# Altium schematic sheet PWM设计.SchDoc
size 1524 x 1524 mm; SheetNumber: 7; SheetTotal: 16
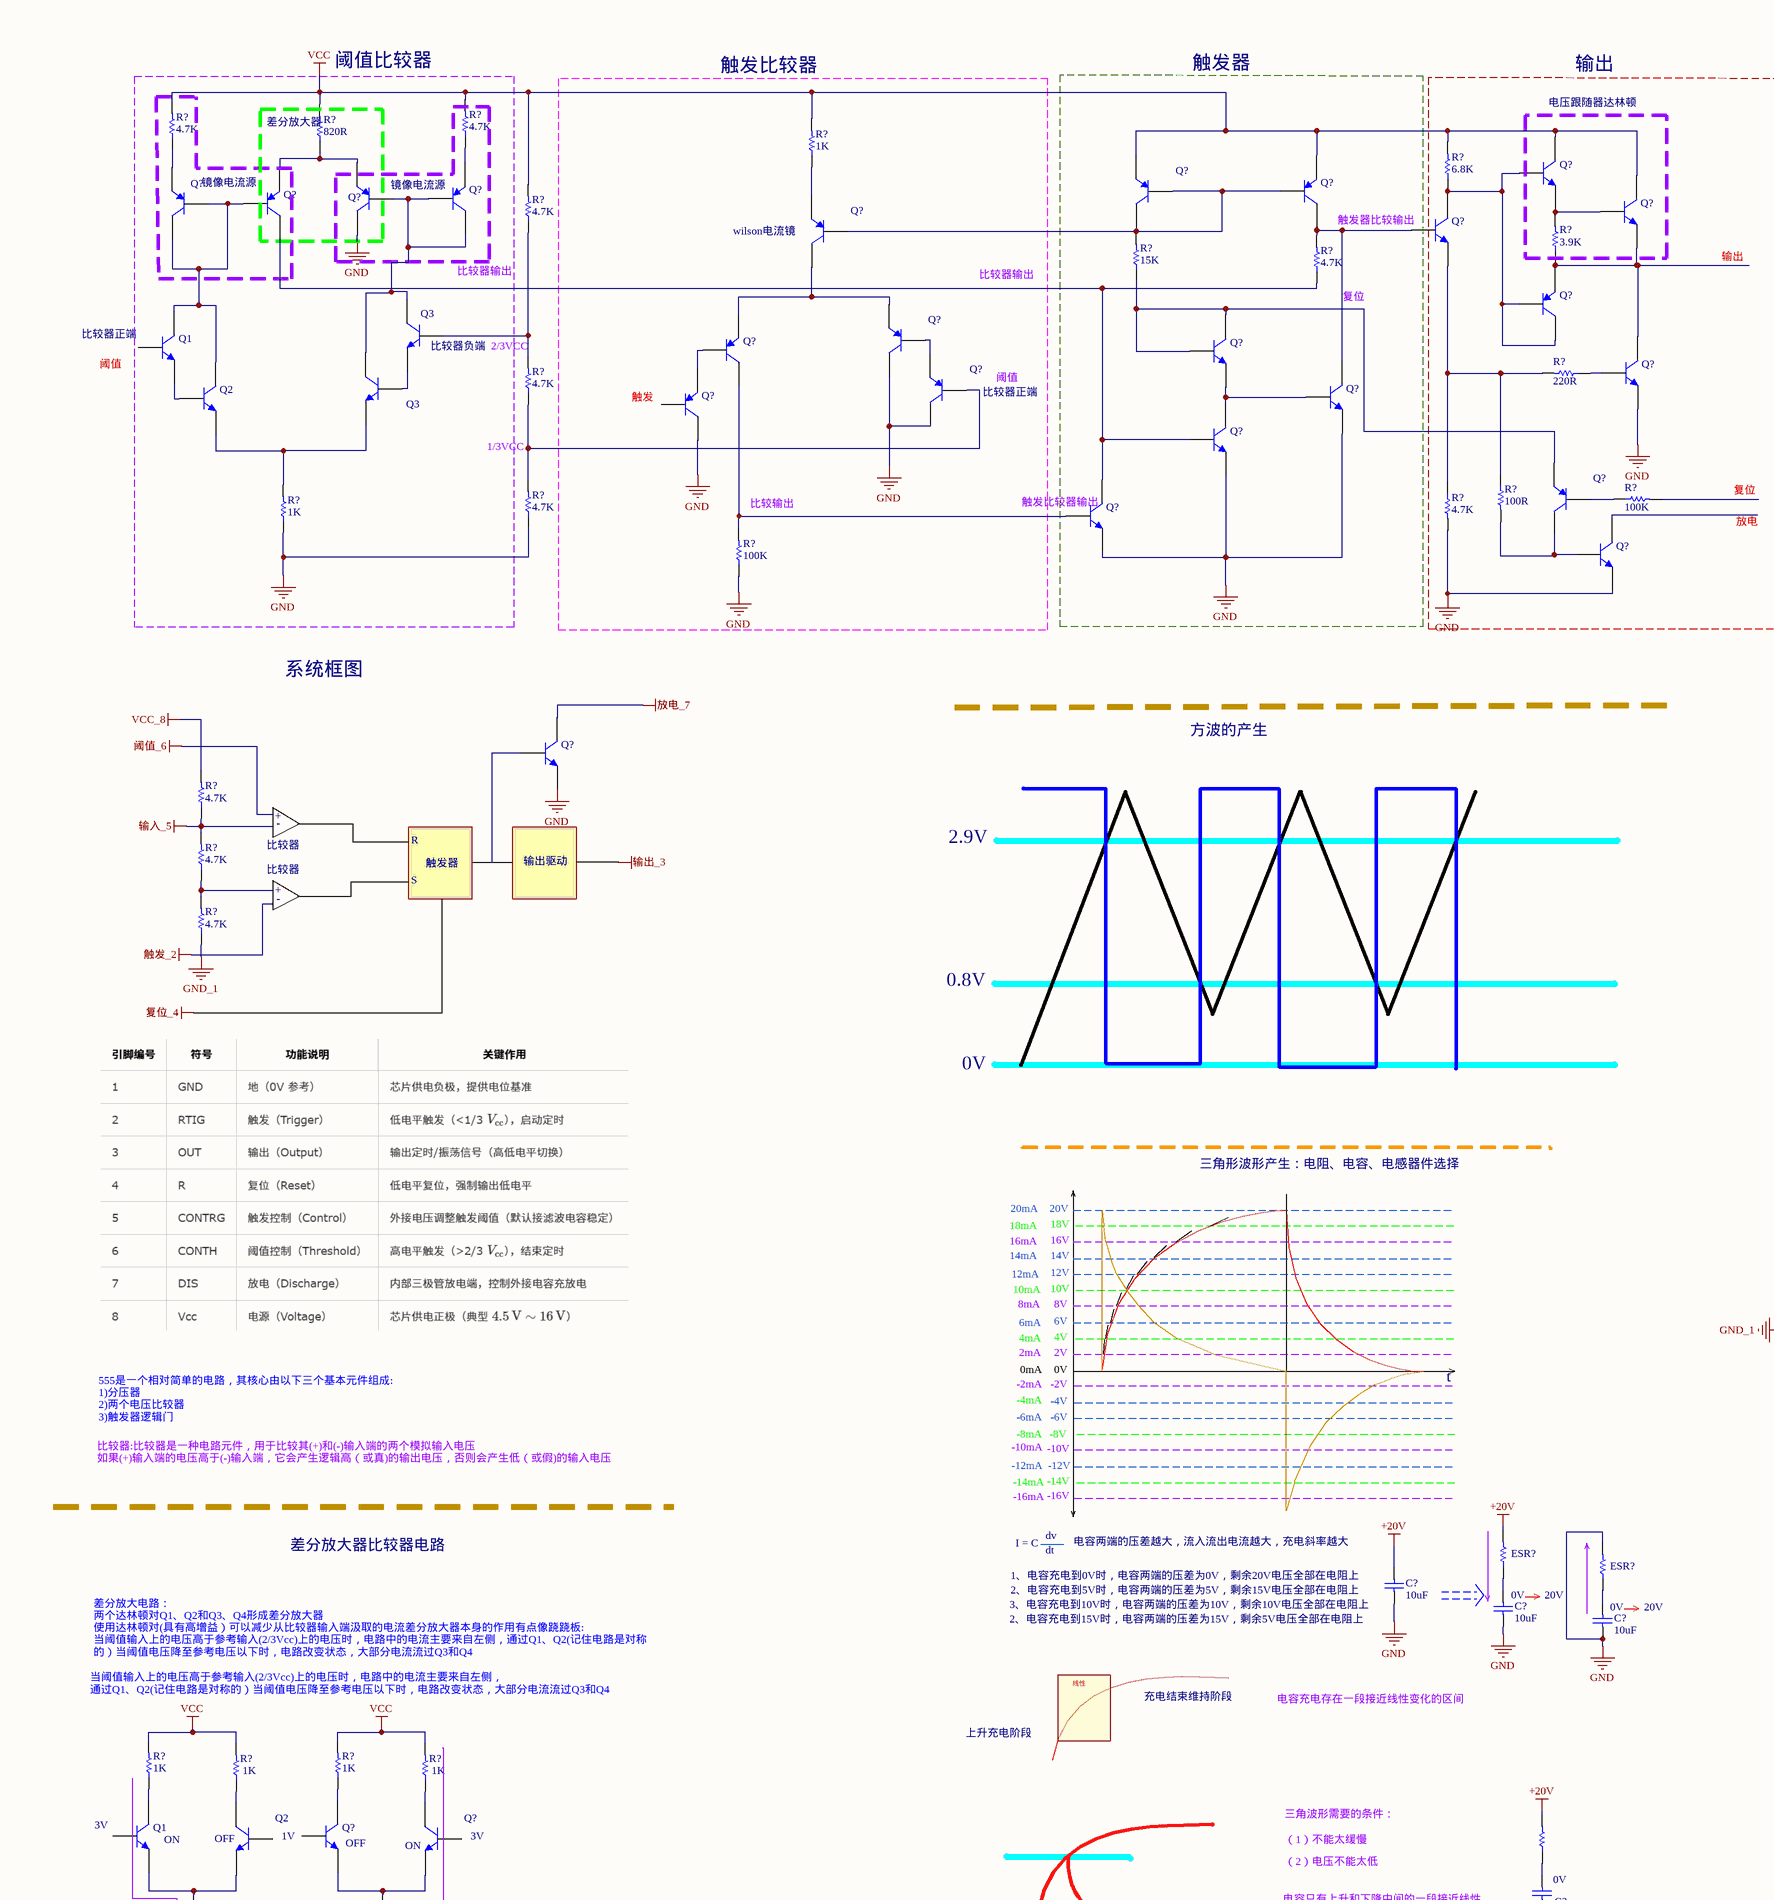
[diagram p0: PWM设计.SchDoc, top column 1 of 4]
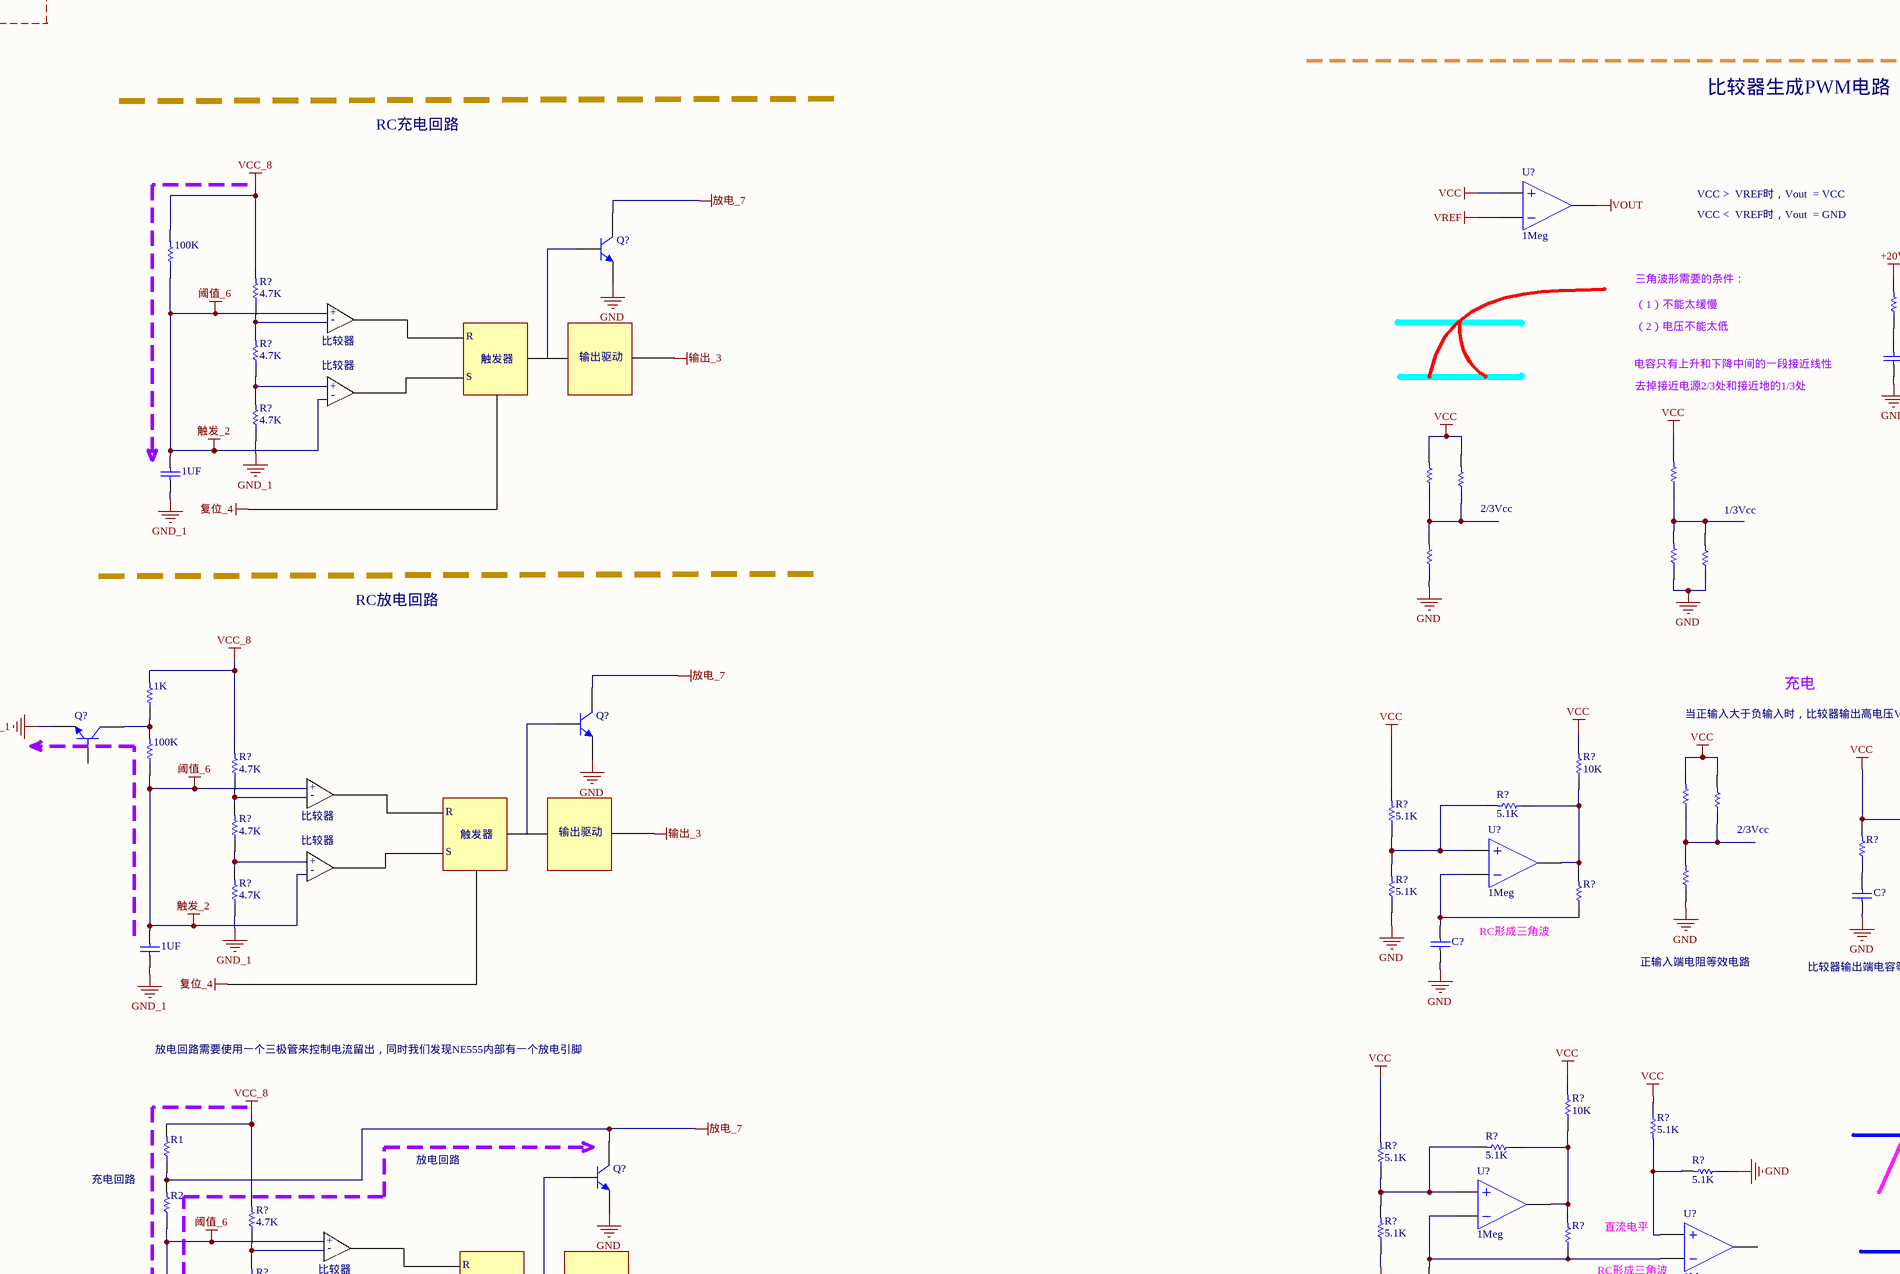
[diagram p1: PWM设计.SchDoc, top column 2 of 4]
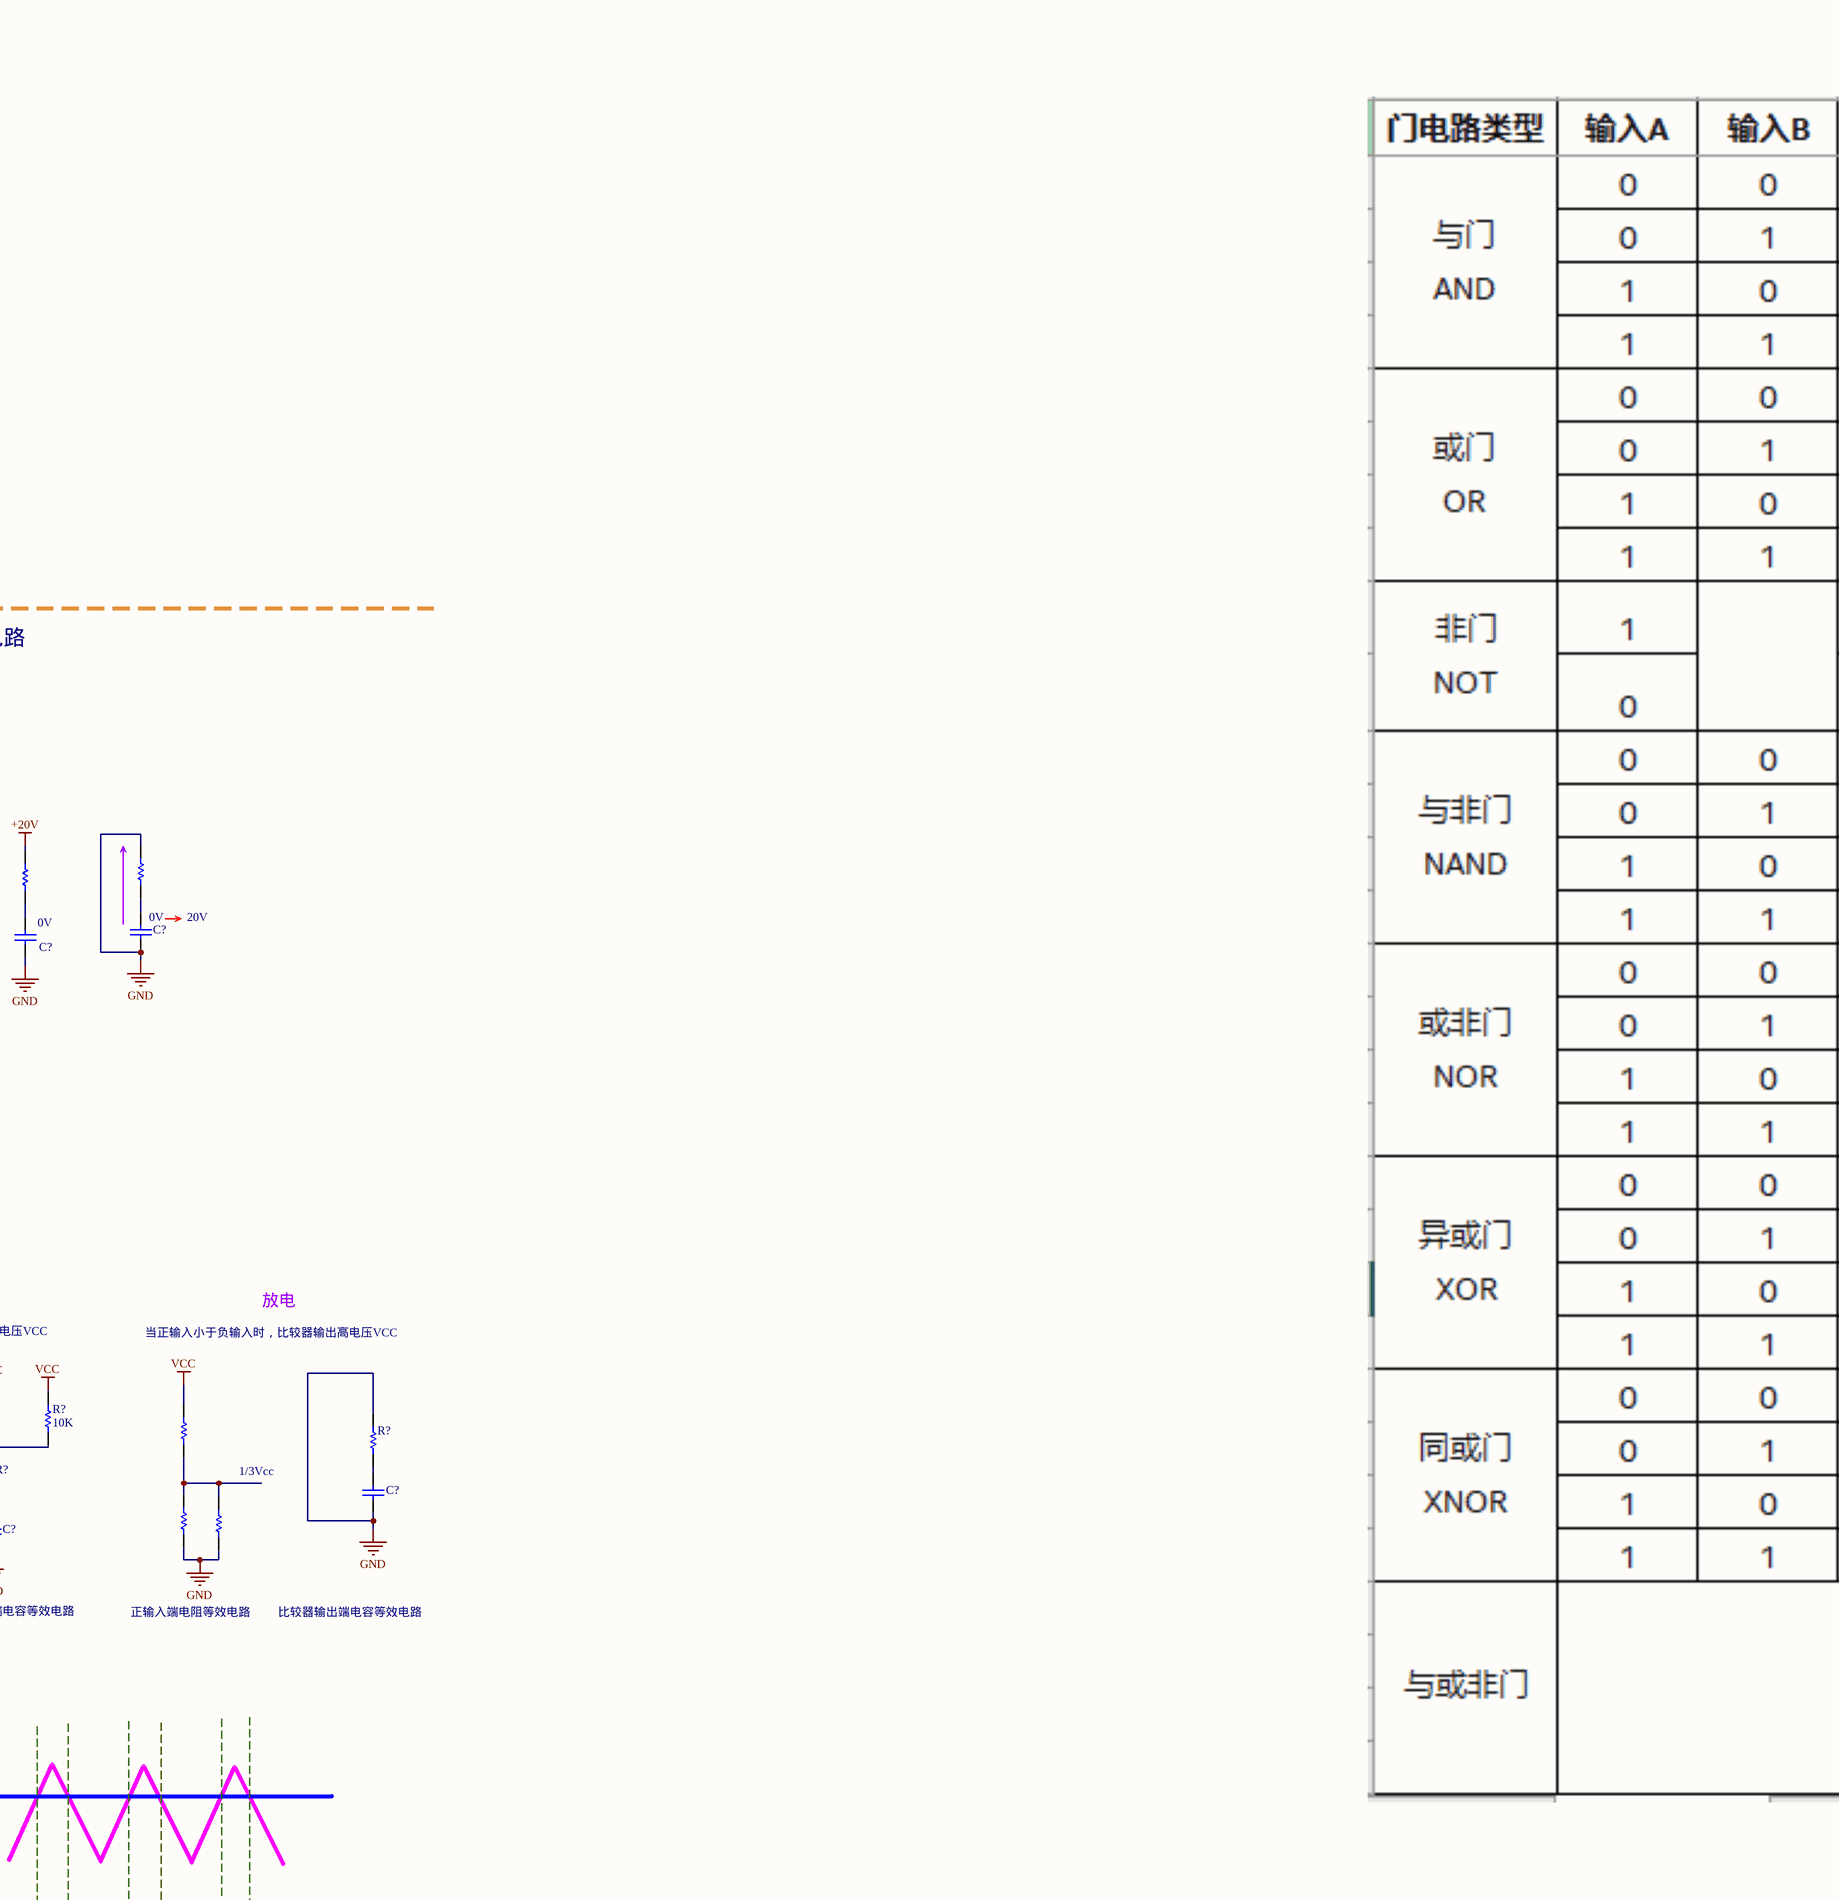
[diagram p2: PWM设计.SchDoc, top column 3 of 4]
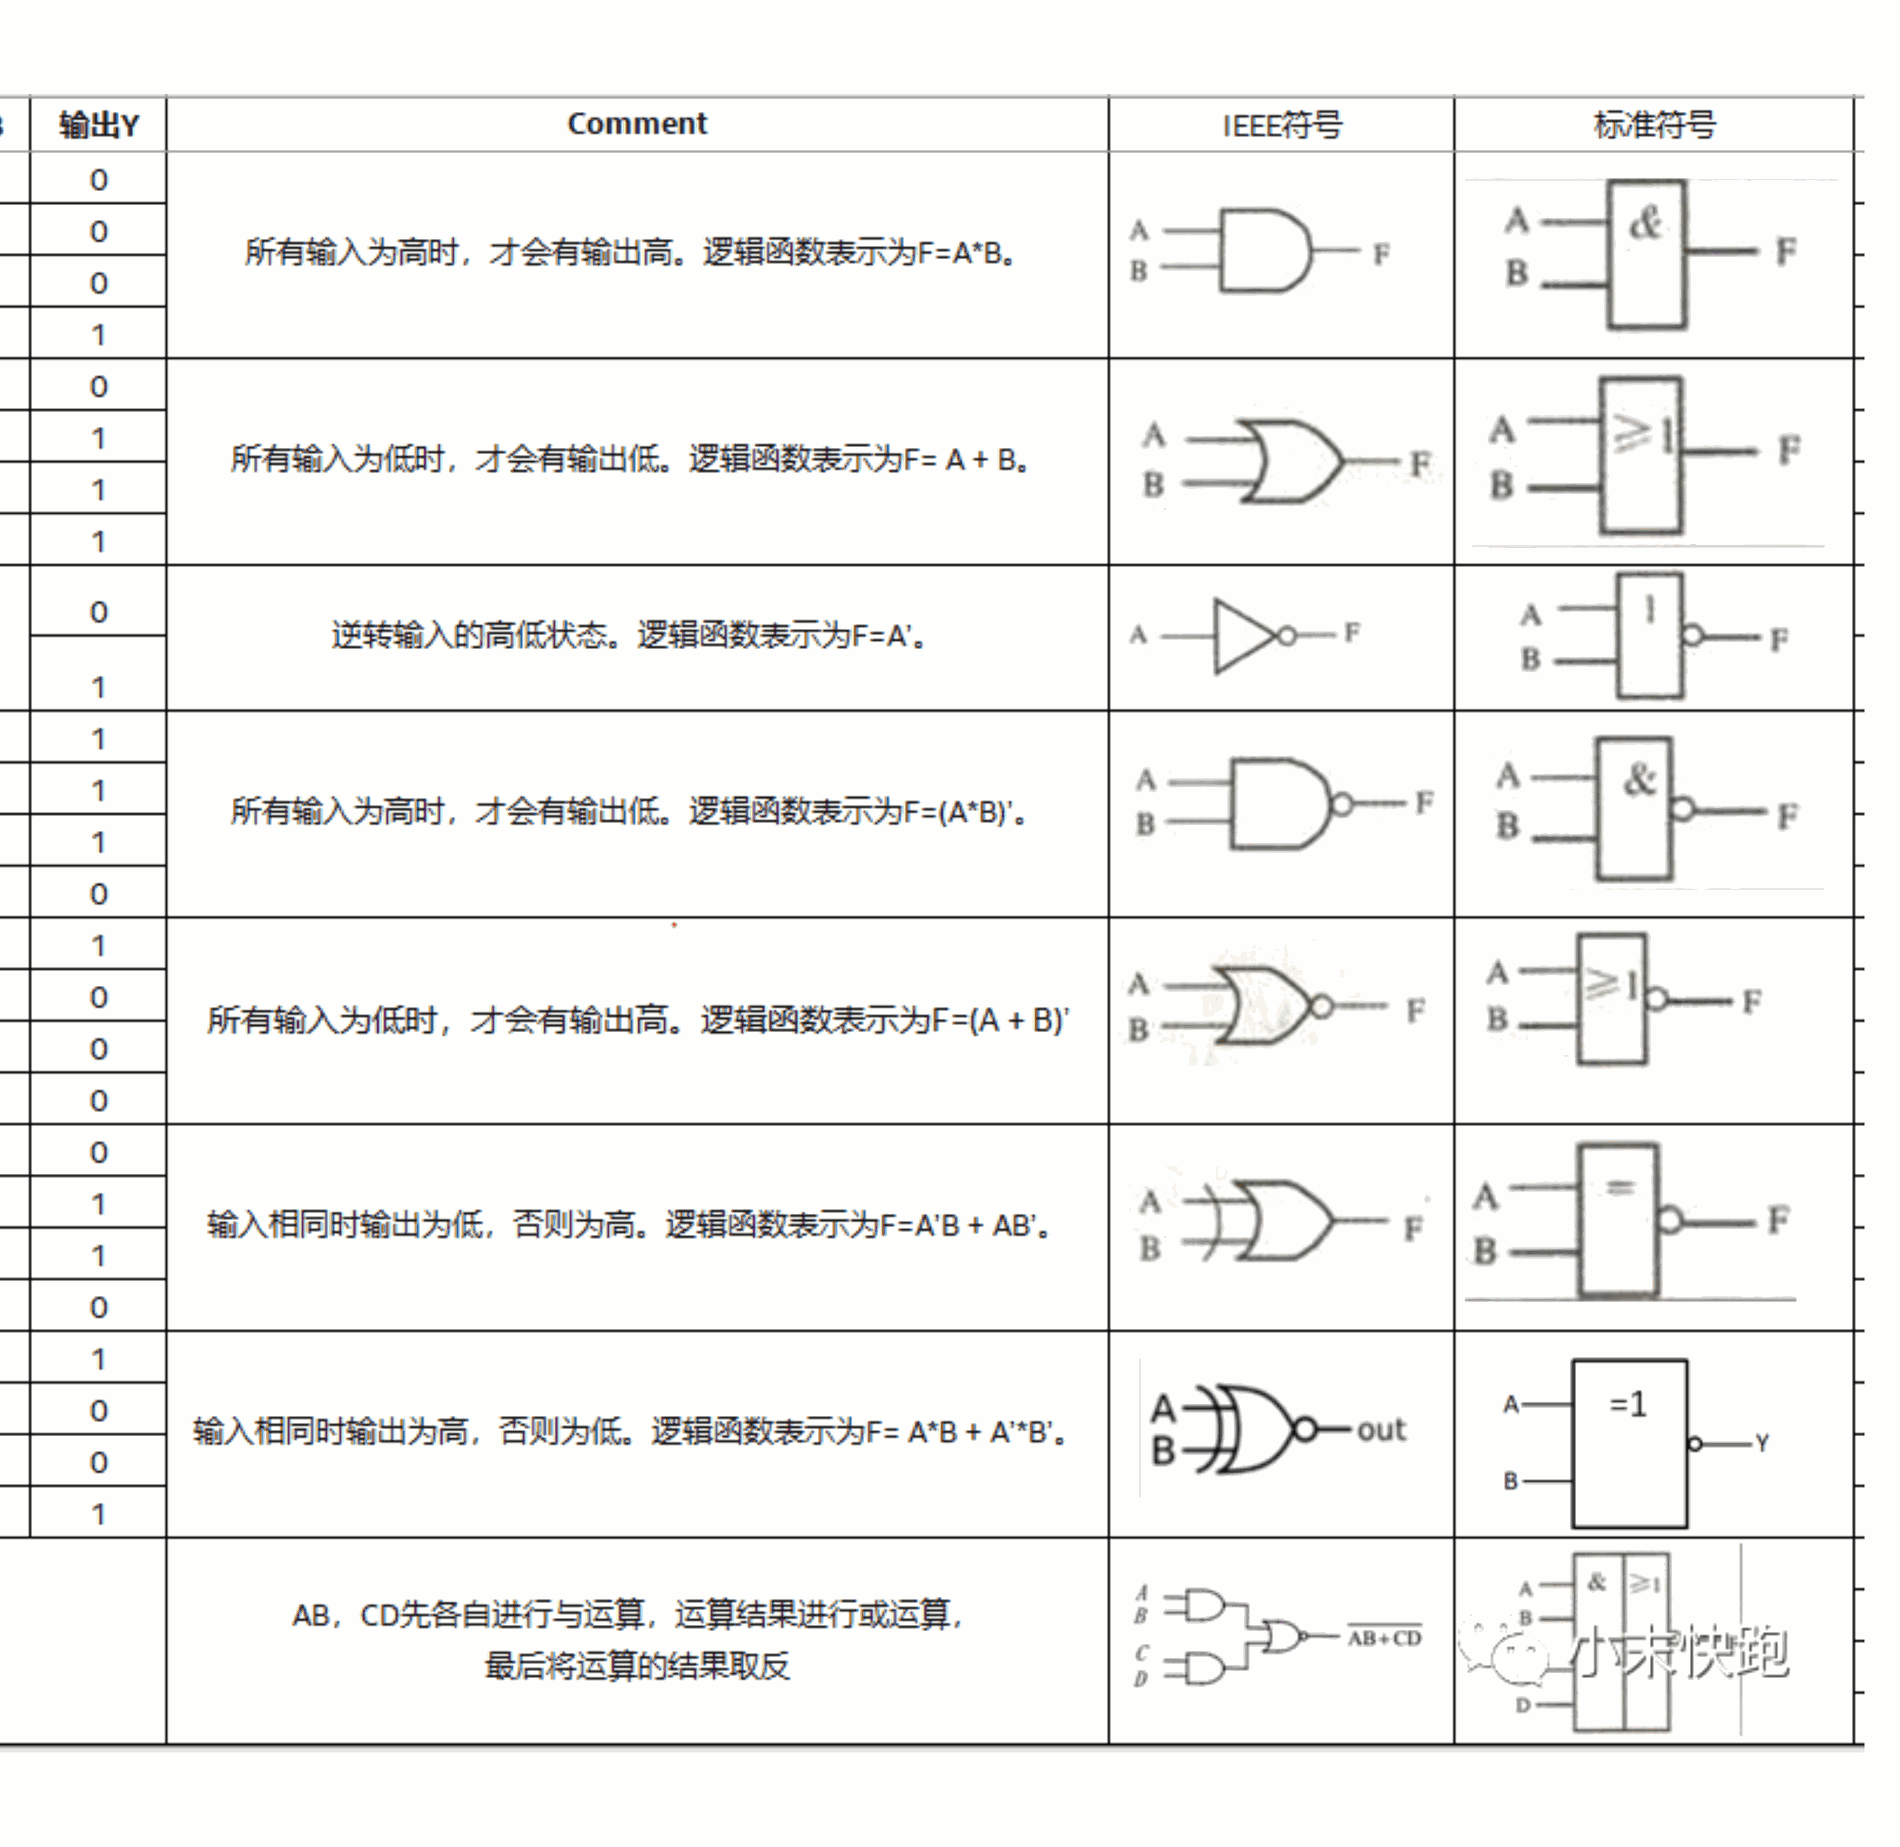
[diagram p3: PWM设计.SchDoc, top column 4 of 4]
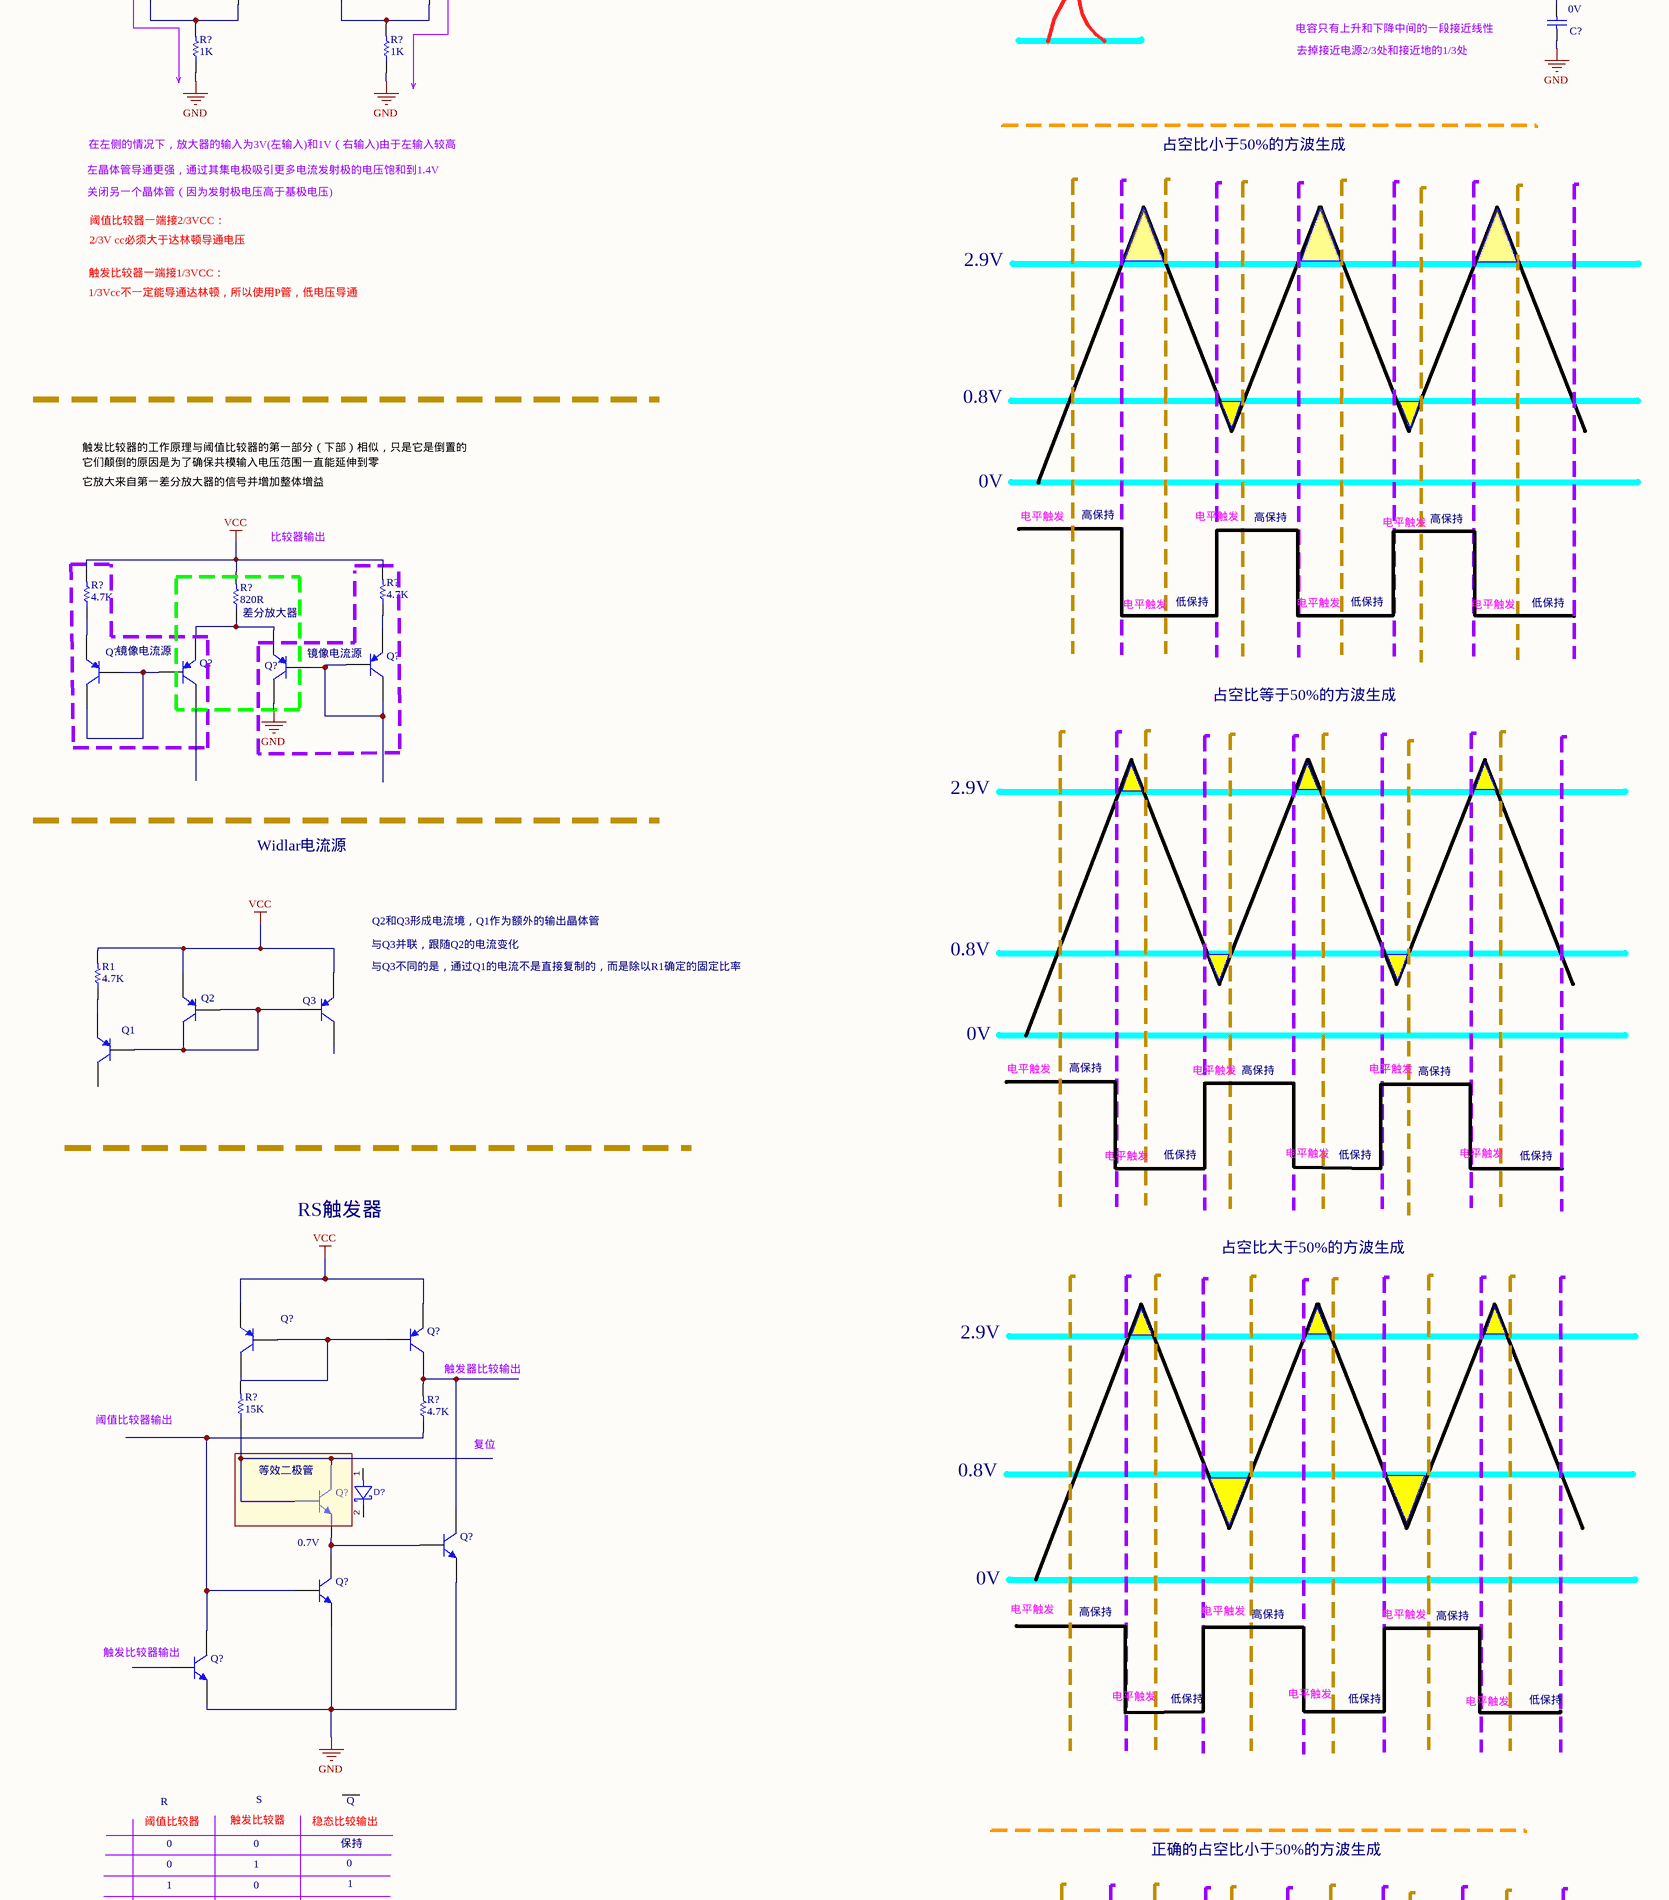
[diagram p4: PWM设计.SchDoc, centre column 1 of 4]
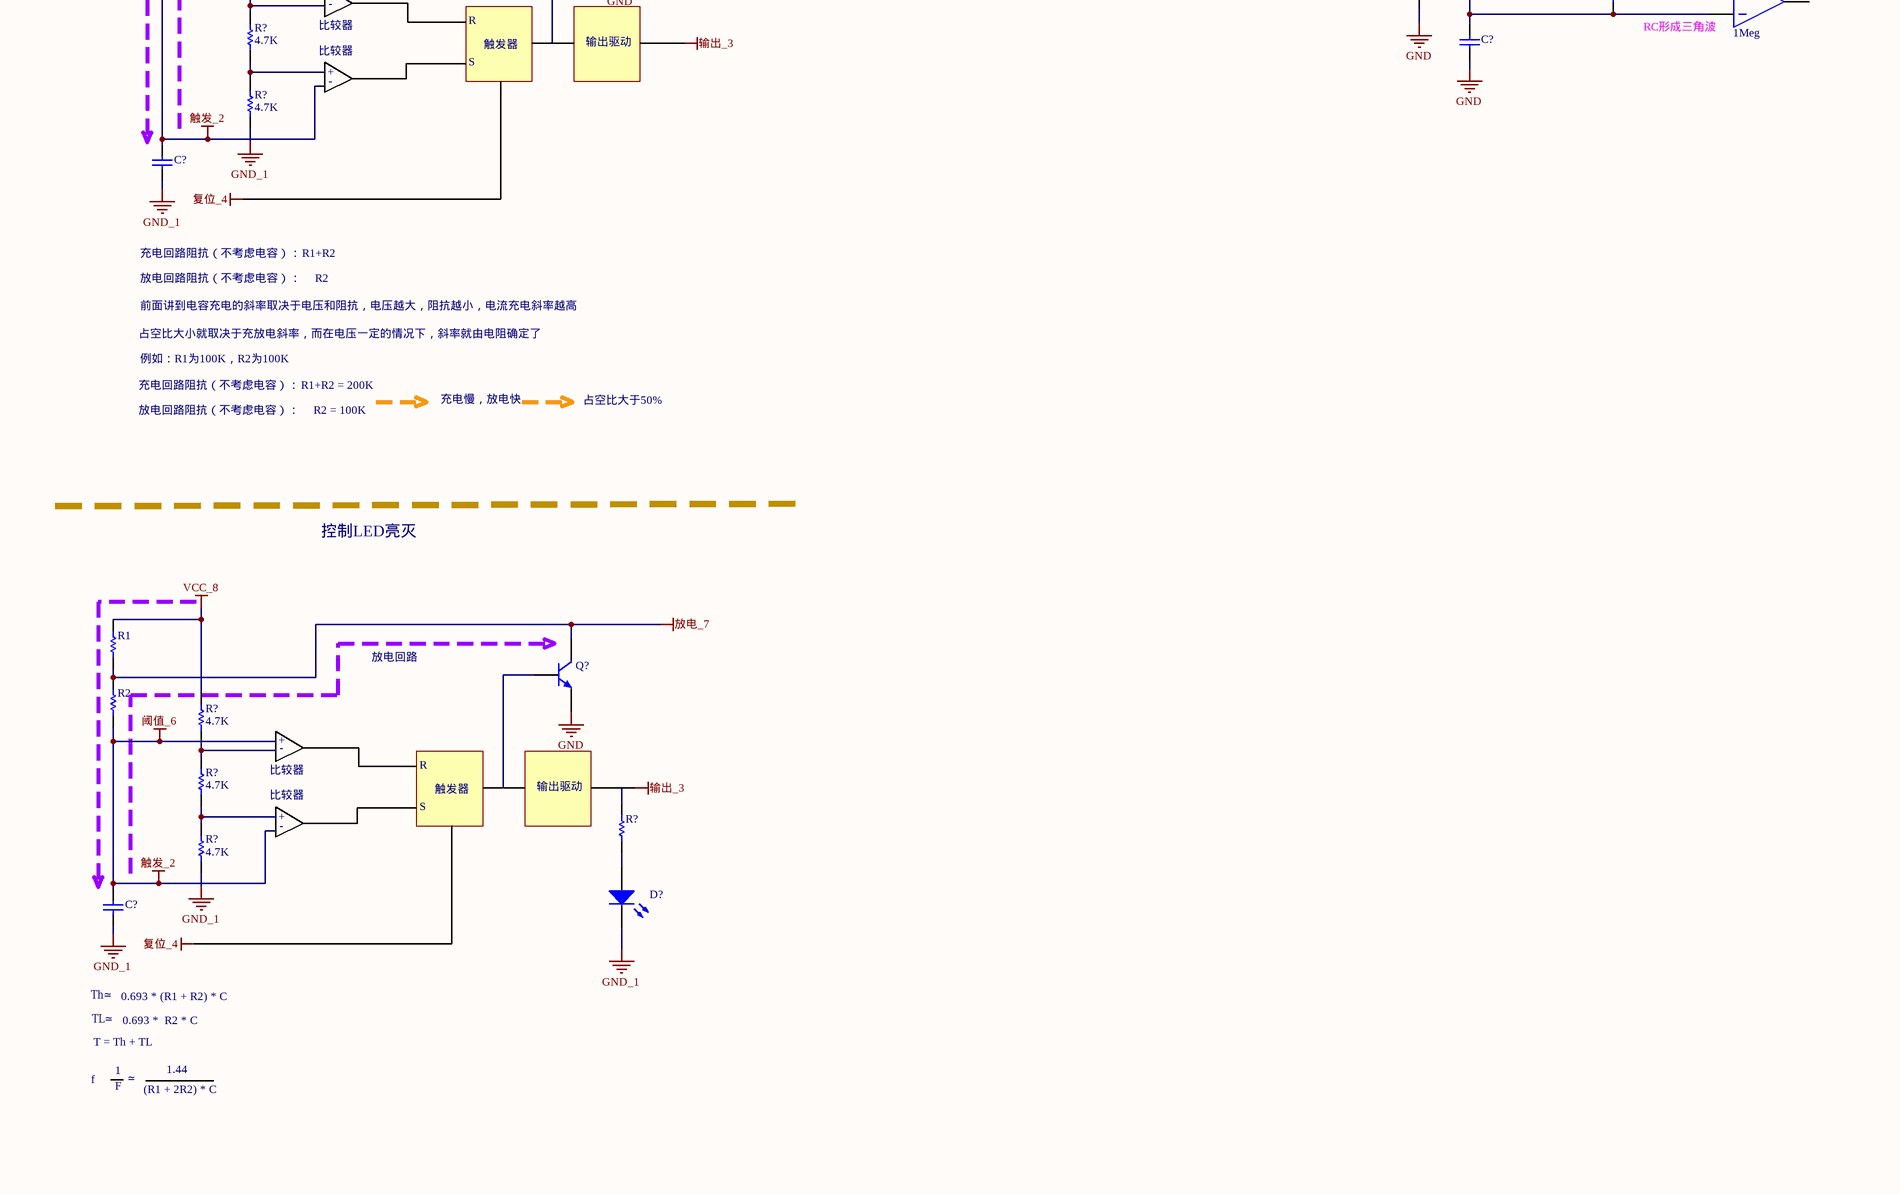
[diagram p5: PWM设计.SchDoc, centre column 2 of 4]
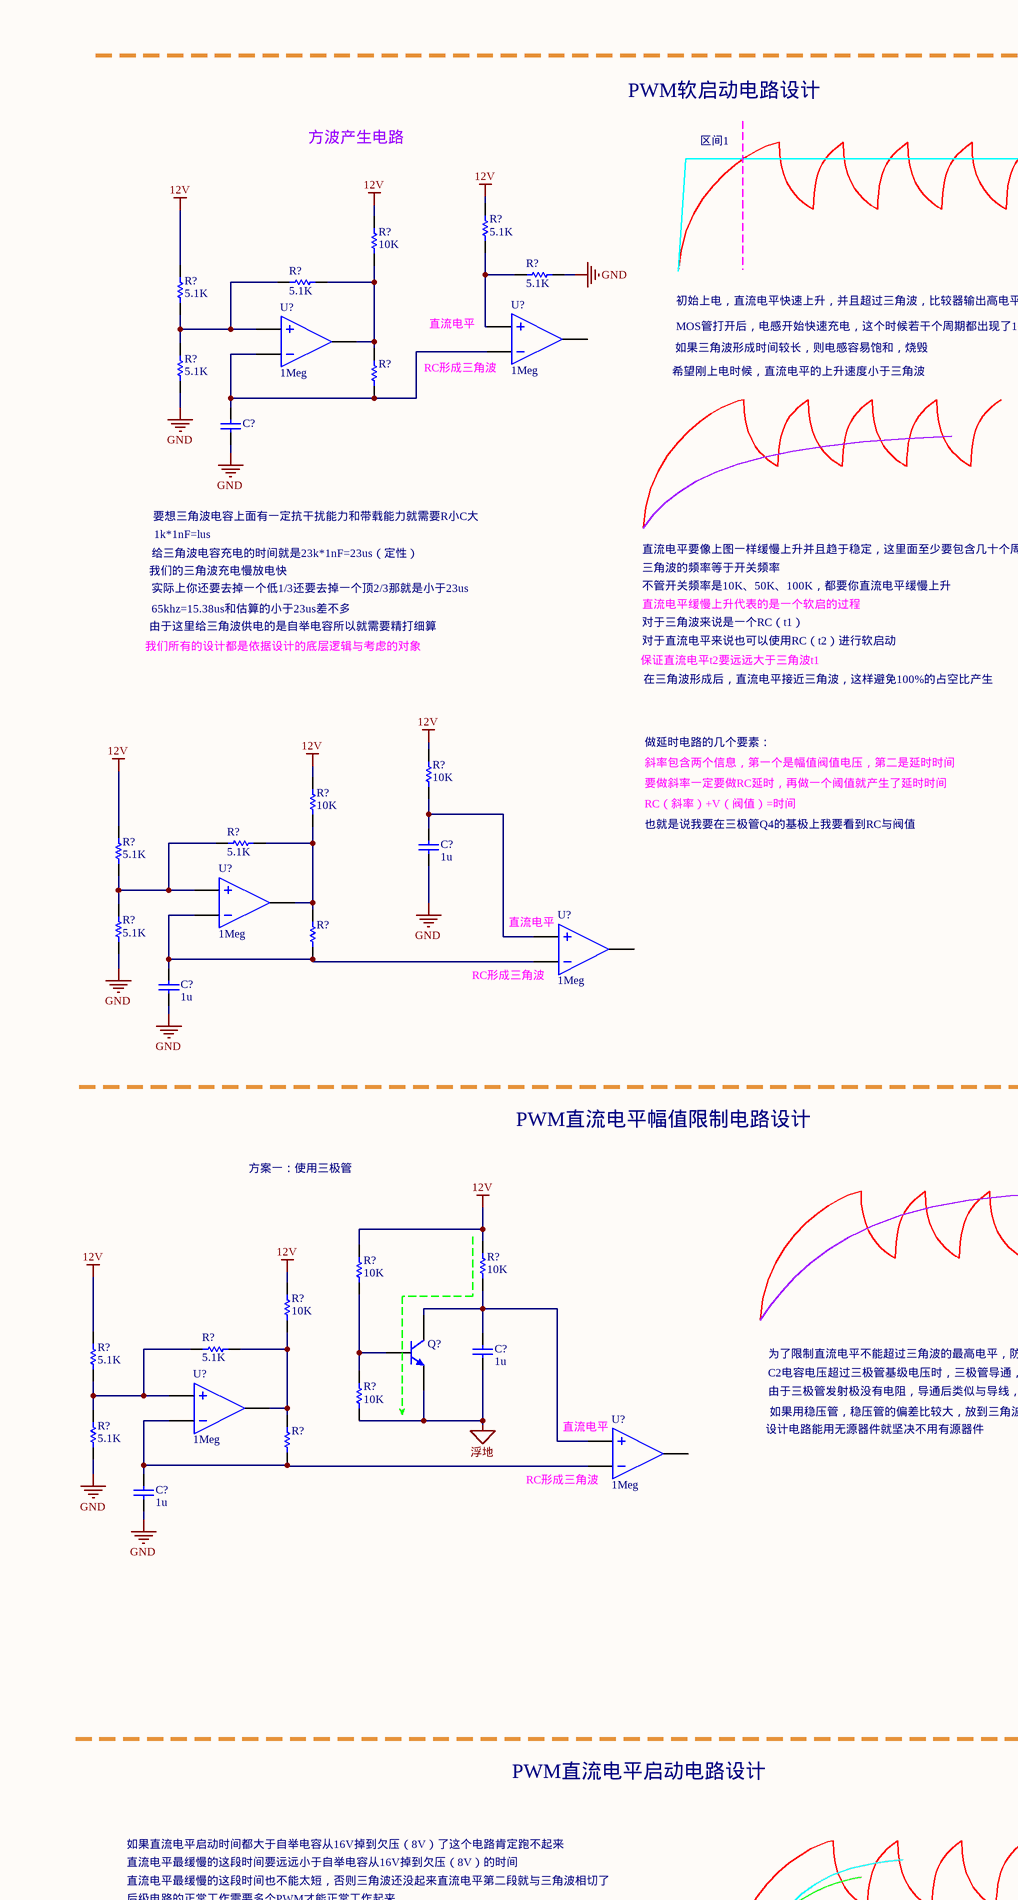
[diagram p6: PWM设计.SchDoc, centre column 3 of 4]
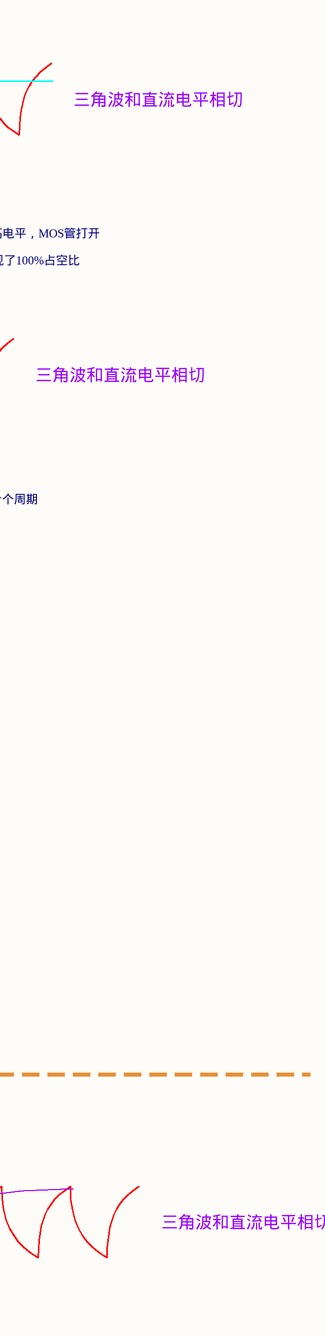
[diagram p7: PWM设计.SchDoc, centre column 4 of 4]
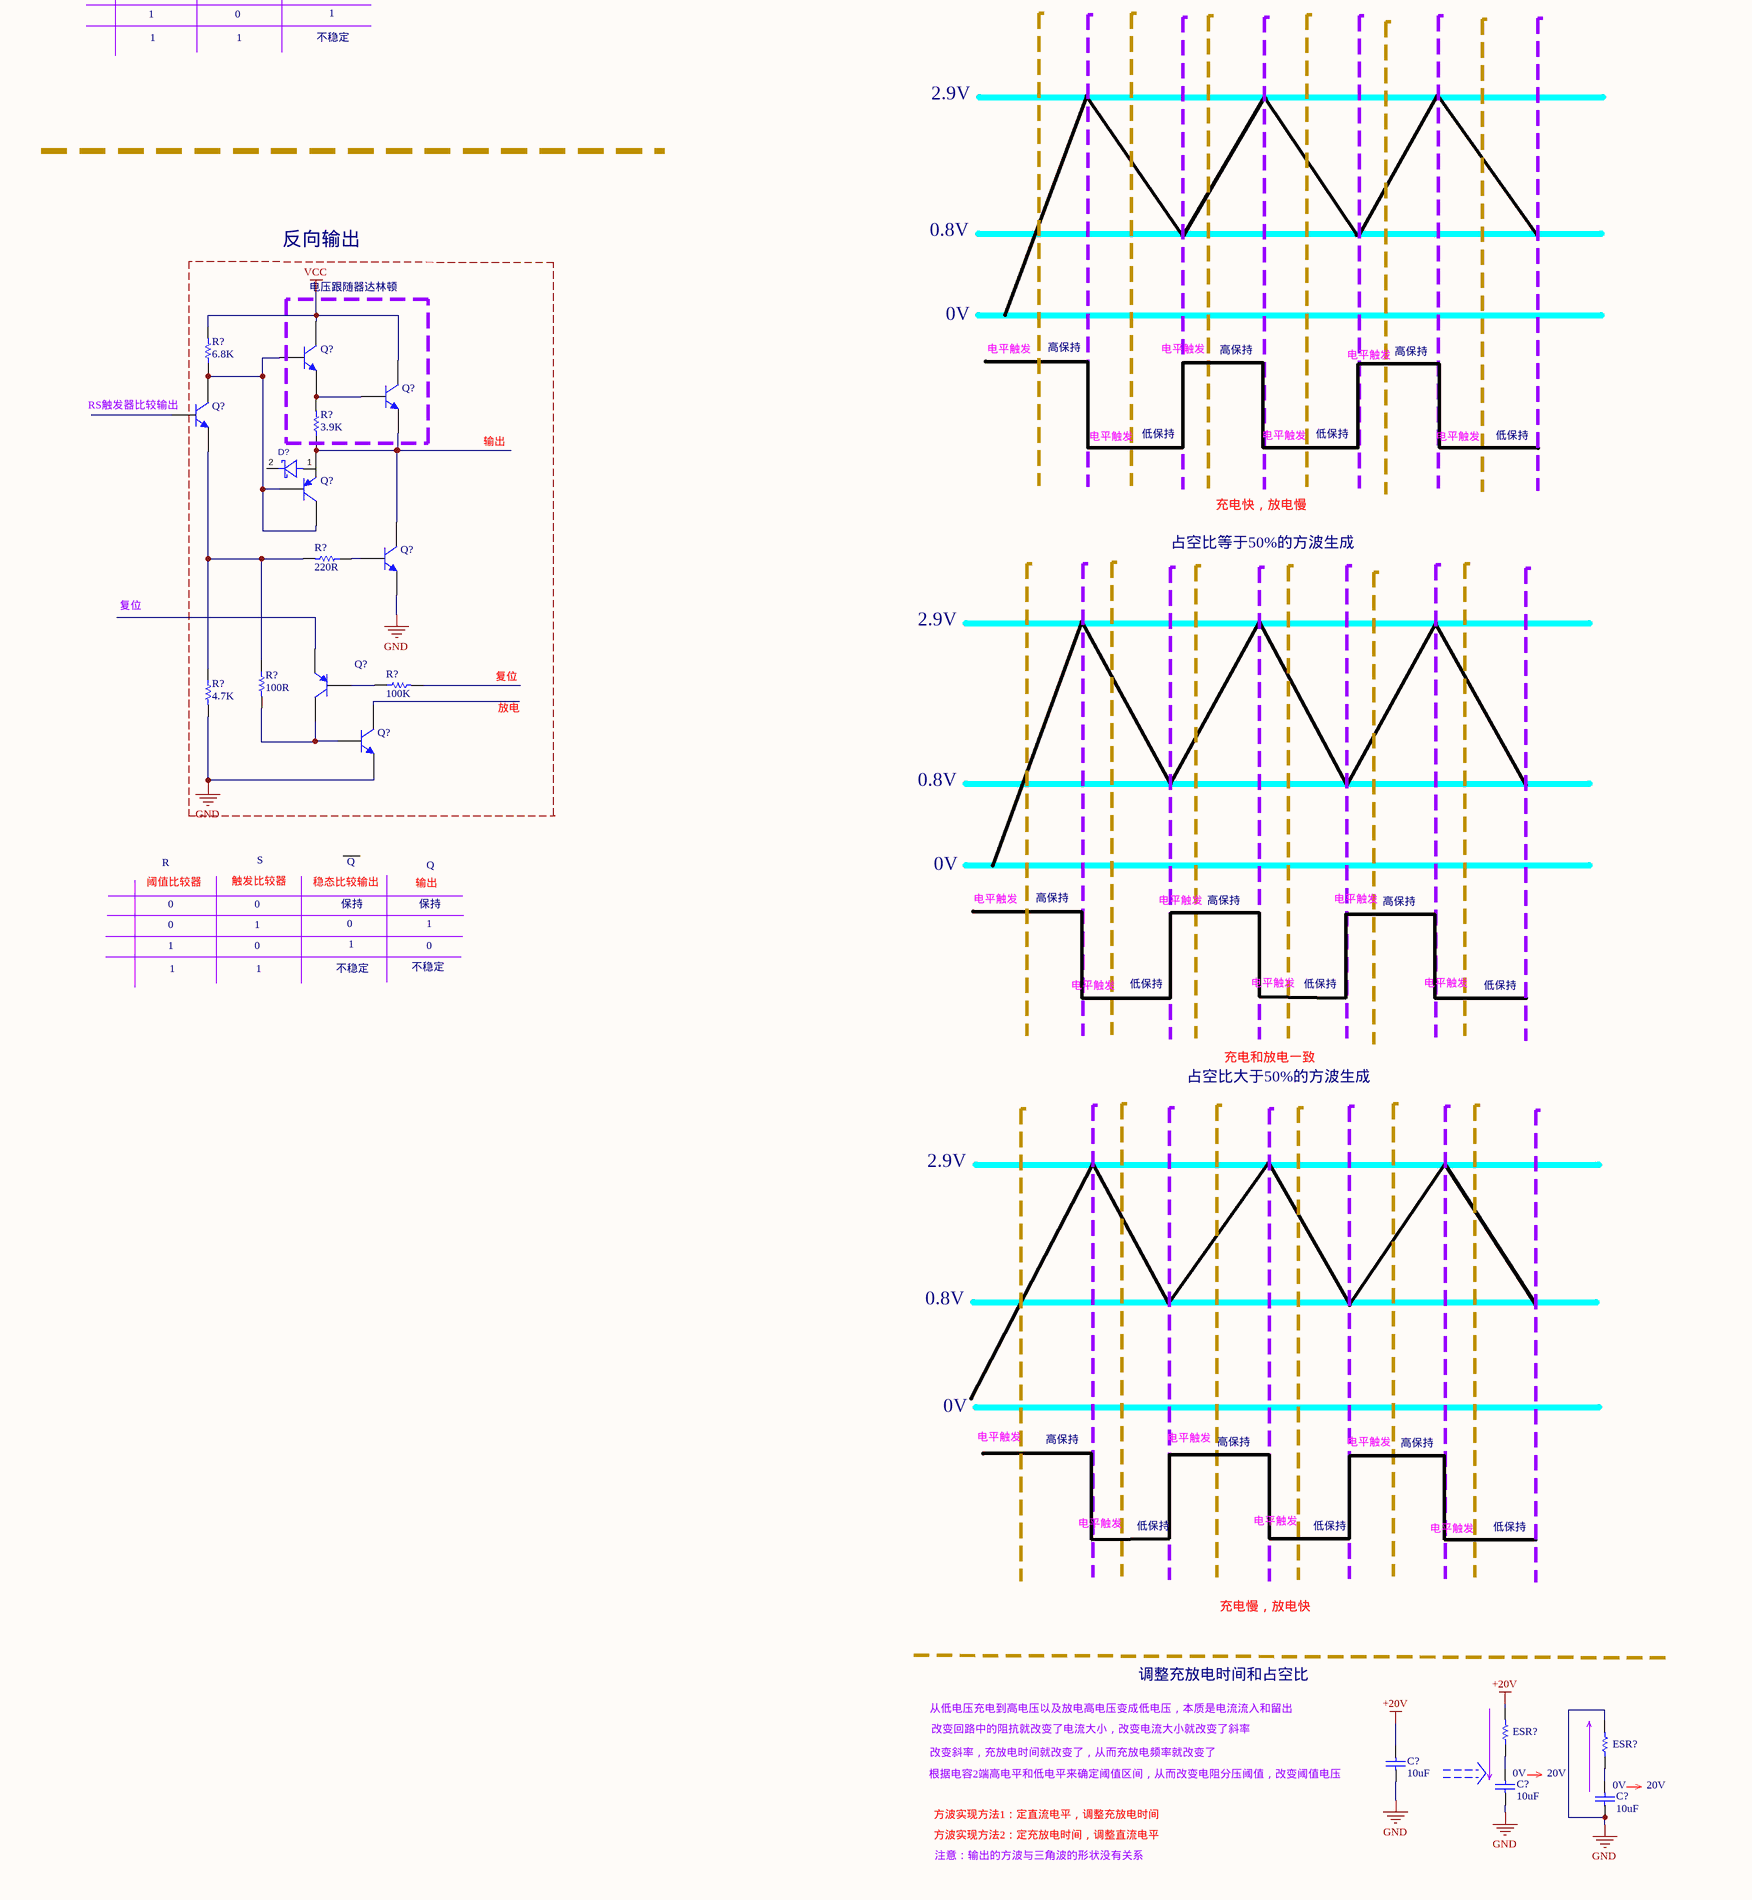
[diagram p8: PWM设计.SchDoc, bottom column 1 of 4]
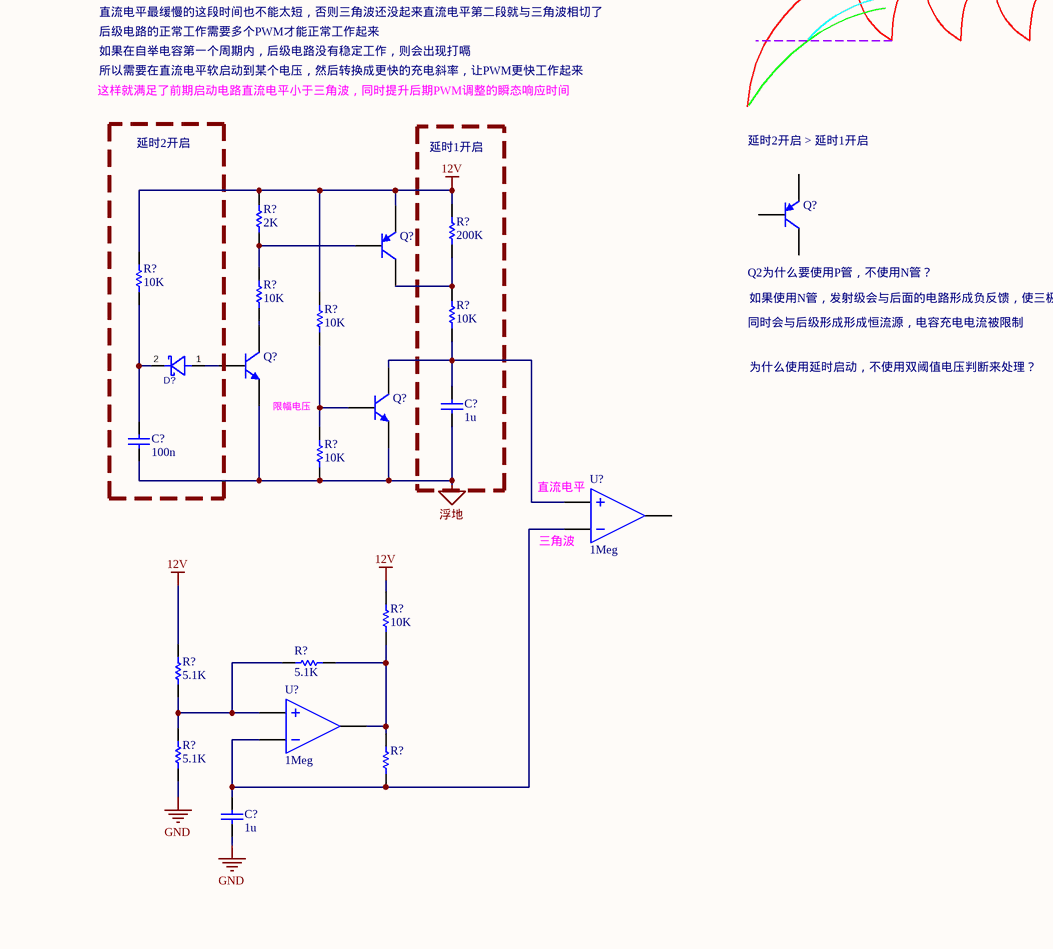
[diagram p9: PWM设计.SchDoc, bottom column 3 of 4]
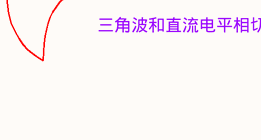
[diagram p10: PWM设计.SchDoc, bottom column 4 of 4]

## Parts
(Parts that share a designator on the sheet are numbered #1, #2 ... from top to bottom, then left to right.)
1K  Resistor  (value not drawn)
1UF#1  Capacitor  (value not drawn)
1UF#2  Capacitor  (value not drawn)
100K#1  Resistor  (value not drawn)
100K#2  Resistor  (value not drawn)
C?#1  Capacitor  (value not drawn)
C?#2  Capacitor  (value not drawn)
C?#3  Capacitor  (value not drawn)
C?#4  Capacitor  (value not drawn)
C?#5  Capacitor  (value not drawn)
C?#6  value 10uF  (hidden comment: Capacitor)
C?#7  value 10uF  (hidden comment: Capacitor)
C?#8  value 10uF  (hidden comment: Capacitor)
C?#9  Capacitor  (value not drawn)
C?#10  Capacitor  (value not drawn)
C?#11  Capacitor  (value not drawn)
C?#12  Capacitor  (value not drawn)
C?#13  Capacitor  (value not drawn)
C?#14  value 1u  (hidden comment: Capacitor)
C?#15  value 1u  (hidden comment: Capacitor)
C?#16  value 1u  (hidden comment: Capacitor)
C?#17  value 1u  (hidden comment: Capacitor)
C?#18  value 1u  (hidden comment: Capacitor)
C?#19  value 100n  (hidden comment: Capacitor)
C?#20  value 1u  (hidden comment: Capacitor)
C?#21  value 10uF  (hidden comment: Capacitor)
C?#22  value 10uF  (hidden comment: Capacitor)
C?#23  value 10uF  (hidden comment: Capacitor)
D?#1  Light-Emitting Diode  (value not drawn)
D?#2  15.7V  (value not drawn)
D?#3  15V  (value not drawn)
D?#4  15.7V  (value not drawn)
ESR?#1  Resistor  (value not drawn)
ESR?#2  Resistor  (value not drawn)
ESR?#3  Resistor  (value not drawn)
ESR?#4  Resistor  (value not drawn)
ESR?#5  Resistor  (value not drawn)
ESR?#6  Resistor  (value not drawn)
ESR?#7  Resistor  (value not drawn)
ESR?#8  Resistor  (value not drawn)
ESR?#9  Resistor  (value not drawn)
ESR?#10  Resistor  (value not drawn)
ESR?#11  Resistor  (value not drawn)
ESR?#12  Resistor  (value not drawn)
ESR?#13  Resistor  (value not drawn)
ESR?#14  Resistor  (value not drawn)
ESR?#15  Resistor  (value not drawn)
ESR?#16  Resistor  (value not drawn)
ESR?#17  Resistor  (value not drawn)
ESR?#18  Resistor  (value not drawn)
ESR?#19  Resistor  (value not drawn)
Q1#1  Bipolar NPN 3 Pins Transistor VBIC Model  (value not drawn)
Q1#2  Bipolar NPN 3 Pins Transistor VBIC Model  (value not drawn)
Q1#3  Bipolar PNP 3 Pins Transistor Gummel-Poon Model  (value not drawn)
Q2#1  Bipolar NPN 3 Pins Transistor VBIC Model  (value not drawn)
Q2#2  Bipolar NPN 3 Pins Transistor VBIC Model  (value not drawn)
Q2#3  Bipolar PNP 3 Pins Transistor Gummel-Poon Model  (value not drawn)
Q3#1  Bipolar NPN 3 Pins Transistor VBIC Model  (value not drawn)
Q3#2  Bipolar NPN 3 Pins Transistor VBIC Model  (value not drawn)
Q3#3  Bipolar PNP 3 Pins Transistor Gummel-Poon Model  (value not drawn)
Q?#1  Bipolar NPN 3 Pins Transistor VBIC Model  (value not drawn)
Q?#2  Bipolar PNP 3 Pins Transistor Gummel-Poon Model  (value not drawn)
Q?#3  Bipolar PNP 3 Pins Transistor Gummel-Poon Model  (value not drawn)
Q?#4  Bipolar PNP 3 Pins Transistor Gummel-Poon Model  (value not drawn)
Q?#5  Bipolar PNP 3 Pins Transistor Gummel-Poon Model  (value not drawn)
Q?#6  Bipolar PNP 3 Pins Transistor Gummel-Poon Model  (value not drawn)
Q?#7  Bipolar PNP 3 Pins Transistor Gummel-Poon Model  (value not drawn)
Q?#8  Bipolar NPN 3 Pins Transistor VBIC Model  (value not drawn)
Q?#9  Bipolar PNP 3 Pins Transistor Gummel-Poon Model  (value not drawn)
Q?#10  Bipolar NPN 3 Pins Transistor VBIC Model  (value not drawn)
Q?#11  Bipolar PNP 3 Pins Transistor Gummel-Poon Model  (value not drawn)
Q?#12  Bipolar PNP 3 Pins Transistor Gummel-Poon Model  (value not drawn)
Q?#13  Bipolar PNP 3 Pins Transistor Gummel-Poon Model  (value not drawn)
Q?#14  Bipolar NPN 3 Pins Transistor VBIC Model  (value not drawn)
Q?#15  Bipolar NPN 3 Pins Transistor VBIC Model  (value not drawn)
Q?#16  Bipolar PNP 3 Pins Transistor Gummel-Poon Model  (value not drawn)
Q?#17  Bipolar NPN 3 Pins Transistor VBIC Model  (value not drawn)
Q?#18  Bipolar PNP 3 Pins Transistor Gummel-Poon Model  (value not drawn)
Q?#19  Bipolar NPN 3 Pins Transistor VBIC Model  (value not drawn)
Q?#20  Bipolar PNP 3 Pins Transistor Gummel-Poon Model  (value not drawn)
Q?#21  Bipolar NPN 3 Pins Transistor VBIC Model  (value not drawn)
Q?#22  Bipolar NPN 3 Pins Transistor VBIC Model  (value not drawn)
Q?#23  Bipolar NPN 3 Pins Transistor VBIC Model  (value not drawn)
Q?#24  Bipolar NPN 3 Pins Transistor VBIC Model  (value not drawn)
Q?#25  Bipolar NPN 3 Pins Transistor VBIC Model  (value not drawn)
Q?#26  Bipolar NPN 3 Pins Transistor VBIC Model  (value not drawn)
Q?#27  Bipolar NPN 3 Pins Transistor VBIC Model  (value not drawn)
Q?#28  Bipolar NPN 3 Pins Transistor VBIC Model  (value not drawn)
Q?#29  Bipolar NPN 3 Pins Transistor VBIC Model  (value not drawn)
Q?#30  Bipolar NPN 3 Pins Transistor VBIC Model  (value not drawn)
Q?#31  Bipolar PNP 3 Pins Transistor Gummel-Poon Model  (value not drawn)
Q?#32  Bipolar PNP 3 Pins Transistor Gummel-Poon Model  (value not drawn)
Q?#33  Bipolar PNP 3 Pins Transistor Gummel-Poon Model  (value not drawn)
Q?#34  Bipolar PNP 3 Pins Transistor Gummel-Poon Model  (value not drawn)
Q?#35  Bipolar PNP 3 Pins Transistor Gummel-Poon Model  (value not drawn)
Q?#36  Bipolar PNP 3 Pins Transistor Gummel-Poon Model  (value not drawn)
Q?#37  Bipolar NPN 3 Pins Transistor VBIC Model  (value not drawn)
Q?#38  Bipolar NPN 3 Pins Transistor VBIC Model  (value not drawn)
Q?#39  Bipolar NPN 3 Pins Transistor VBIC Model  (value not drawn)
Q?#40  Bipolar NPN 3 Pins Transistor VBIC Model  (value not drawn)
Q?#41  Bipolar NPN 3 Pins Transistor VBIC Model  (value not drawn)
Q?#42  Bipolar PNP 3 Pins Transistor Gummel-Poon Model  (value not drawn)
Q?#43  Bipolar PNP 3 Pins Transistor Gummel-Poon Model  (value not drawn)
Q?#44  Bipolar NPN 3 Pins Transistor VBIC Model  (value not drawn)
Q?#45  Bipolar NPN 3 Pins Transistor VBIC Model  (value not drawn)
Q?#46  Bipolar NPN 3 Pins Transistor VBIC Model  (value not drawn)
Q?#47  Bipolar NPN 3 Pins Transistor VBIC Model  (value not drawn)
Q?#48  Bipolar NPN 3 Pins Transistor VBIC Model  (value not drawn)
Q?#49  Bipolar PNP 3 Pins Transistor Gummel-Poon Model  (value not drawn)
Q?#50  Bipolar NPN 3 Pins Transistor VBIC Model  (value not drawn)
Q?#51  Bipolar PNP 3 Pins Transistor Gummel-Poon Model  (value not drawn)
Q?#52  Bipolar NPN 3 Pins Transistor VBIC Model  (value not drawn)
R1#1  Resistor  (value not drawn)
R1#2  Resistor  (value not drawn)
R1#3  value 4.7K  (hidden comment: Resistor)
R2#1  Resistor  (value not drawn)
R2#2  Resistor  (value not drawn)
R?#1  value 4.7K  (hidden comment: Resistor)
R?#2  value 820R  (hidden comment: Resistor)
R?#3  value 4.7K  (hidden comment: Resistor)
R?#4  value 1K  (hidden comment: Resistor)
R?#5  value 6.8K  (hidden comment: Resistor)
R?#6  value 4.7K  (hidden comment: Resistor)
R?#7  value 3.9K  (hidden comment: Resistor)
R?#8  value 15K  (hidden comment: Resistor)
R?#9  value 4.7K  (hidden comment: Resistor)
R?#10  value 220R  (hidden comment: Resistor)
R?#11  value 4.7K  (hidden comment: Resistor)
R?#12  value 100R  (hidden comment: Resistor)
R?#13  value 4.7K  (hidden comment: Resistor)
R?#14  value 100K  (hidden comment: Resistor)
R?#15  value 4.7K  (hidden comment: Resistor)
R?#16  value 1K  (hidden comment: Resistor)
R?#17  value 100K  (hidden comment: Resistor)
R?#18  value 4.7K  (hidden comment: Resistor)
R?#19  value 4.7K  (hidden comment: Resistor)
R?#20  value 4.7K  (hidden comment: Resistor)
R?#21  value 4.7K  (hidden comment: Resistor)
R?#22  value 4.7K  (hidden comment: Resistor)
R?#23  value 4.7K  (hidden comment: Resistor)
R?#24  value 4.7K  (hidden comment: Resistor)
R?#25  value 10K  (hidden comment: Resistor)
R?#26  value 5.1K  (hidden comment: Resistor)
R?#27  value 10K  (hidden comment: Resistor)
R?#28  value 5.1K  (hidden comment: Resistor)
R?#29  Resistor  (value not drawn)
R?#30  value 4.7K  (hidden comment: Resistor)
R?#31  Resistor  (value not drawn)
R?#32  value 5.1K  (hidden comment: Resistor)
R?#33  value 4.7K  (hidden comment: Resistor)
R?#34  Resistor  (value not drawn)
R?#35  value 5.1K  (hidden comment: Resistor)
R?#36  value 10K  (hidden comment: Resistor)
R?#37  value 5.1K  (hidden comment: Resistor)
R?#38  value 5.1K  (hidden comment: Resistor)
R?#39  value 5.1K  (hidden comment: Resistor)
R?#40  value 1K  (hidden comment: Resistor)
R?#41  value 1K  (hidden comment: Resistor)
R?#42  value 1K  (hidden comment: Resistor)
R?#43  value 1K  (hidden comment: Resistor)
R?#44  value 4.7K  (hidden comment: Resistor)
R?#45  value 5.1K  (hidden comment: Resistor)
R?#46  Resistor  (value not drawn)
R?#47  value 4.7K  (hidden comment: Resistor)
R?#48  value 1K  (hidden comment: Resistor)
R?#49  value 1K  (hidden comment: Resistor)
R?#50  value 4.7K  (hidden comment: Resistor)
R?#51  value 5.1K  (hidden comment: Resistor)
R?#52  value 10K  (hidden comment: Resistor)
R?#53  value 5.1K  (hidden comment: Resistor)
R?#54  value 5.1K  (hidden comment: Resistor)
R?#55  value 5.1K  (hidden comment: Resistor)
R?#56  value 5.1K  (hidden comment: Resistor)
R?#57  Resistor  (value not drawn)
R?#58  value 4.7K  (hidden comment: Resistor)
R?#59  value 4.7K  (hidden comment: Resistor)
R?#60  value 820R  (hidden comment: Resistor)
R?#61  value 4.7K  (hidden comment: Resistor)
R?#62  value 4.7K  (hidden comment: Resistor)
R?#63  value 10K  (hidden comment: Resistor)
R?#64  Resistor  (value not drawn)
R?#65  value 4.7K  (hidden comment: Resistor)
R?#66  value 10K  (hidden comment: Resistor)
R?#67  value 5.1K  (hidden comment: Resistor)
R?#68  value 5.1K  (hidden comment: Resistor)
R?#69  value 5.1K  (hidden comment: Resistor)
R?#70  Resistor  (value not drawn)
R?#71  value 10K  (hidden comment: Resistor)
R?#72  value 10K  (hidden comment: Resistor)
R?#73  value 10K  (hidden comment: Resistor)
R?#74  value 5.1K  (hidden comment: Resistor)
R?#75  value 10K  (hidden comment: Resistor)
R?#76  value 5.1K  (hidden comment: Resistor)
R?#77  value 15K  (hidden comment: Resistor)
R?#78  value 4.7K  (hidden comment: Resistor)
R?#79  value 5.1K  (hidden comment: Resistor)
R?#80  Resistor  (value not drawn)
R?#81  value 2K  (hidden comment: Resistor)
R?#82  value 200K  (hidden comment: Resistor)
R?#83  value 10K  (hidden comment: Resistor)
R?#84  value 10K  (hidden comment: Resistor)
R?#85  value 10K  (hidden comment: Resistor)
R?#86  value 10K  (hidden comment: Resistor)
R?#87  value 6.8K  (hidden comment: Resistor)
R?#88  value 10K  (hidden comment: Resistor)
R?#89  value 3.9K  (hidden comment: Resistor)
R?#90  value 220R  (hidden comment: Resistor)
R?#91  value 10K  (hidden comment: Resistor)
R?#92  value 5.1K  (hidden comment: Resistor)
R?#93  value 5.1K  (hidden comment: Resistor)
R?#94  value 100R  (hidden comment: Resistor)
R?#95  value 4.7K  (hidden comment: Resistor)
R?#96  value 100K  (hidden comment: Resistor)
R?#97  value 5.1K  (hidden comment: Resistor)
R?#98  Resistor  (value not drawn)
U?#1  GAIN: 1Meg  (hidden comment: Ideal Operational Amplifier)
U?#2  GAIN: 1Meg  (hidden comment: Ideal Operational Amplifier)
U?#3  GAIN: 1Meg  (hidden comment: Ideal Operational Amplifier)
U?#4  GAIN: 1Meg  (hidden comment: Ideal Operational Amplifier)
U?#5  GAIN: 1Meg  (hidden comment: Ideal Operational Amplifier)
U?#6  GAIN: 1Meg  (hidden comment: Ideal Operational Amplifier)
U?#7  GAIN: 1Meg  (hidden comment: Ideal Operational Amplifier)
U?#8  GAIN: 1Meg  (hidden comment: Ideal Operational Amplifier)
U?#9  GAIN: 1Meg  (hidden comment: Ideal Operational Amplifier)
U?#10  GAIN: 1Meg  (hidden comment: Ideal Operational Amplifier)
U?#11  GAIN: 1Meg  (hidden comment: Ideal Operational Amplifier)
U?#12  GAIN: 1Meg  (hidden comment: Ideal Operational Amplifier)

## Blocks framed on the sheet
阈值比较器: Q1#1 Q2#1 Q3#1 Q3#2 R?#16
触发器: Q?#2 Q?#3 Q?#14 Q?#17 Q?#19 Q?#21 R?#8 R?#9
输出: Q?#10 Q?#11 Q?#15 Q?#20 Q?#22 R?#5 R?#10 R?#12-R?#14
镜像电流源: Q?#6 R?#1
差分放大器: Q?#7 R?#2
镜像电流源: Q?#4 Q?#5 R?#3
触发比较器: Q?#9 Q?#12 Q?#13 Q?#16 Q?#18 R?#4 R?#17
电压跟随器达林顿: Q?#1 Q?#8 R?#7
镜像电流源: Q?#33 R?#58
差分放大器: Q?#31 Q?#34 R?#60
等效二极管: Q?#38
延时2开启: C?#19 D?#3 R?#83
延时1开启: C?#18 R?#82 R?#86
反向输出: D?#4 Q?#48-Q?#52 R?#87 R?#90 R?#94-R?#96
电压跟随器达林顿: Q?#45 Q?#47 R?#89

## Nets
12V: Q?#43.3(E) R?#51.1 R?#52.2 R?#55.2 R?#63.1 R?#66.2 R?#68.2 R?#71.1 R?#72.1 R?#73.2 R?#76.2 R?#81.1 R?#82.1 R?#83.1 R?#85.1 R?#91.2 R?#93.2
+20V: C?#6.2 C?#21.2 ESR?#2.2 ESR?#15.2 ESR?#17.2 ESR?#18.2
GND: C?#1.1 C?#2.1 C?#3.1 C?#4.1 C?#5.1 C?#6.1 C?#7.1 C?#8.1 C?#9.1 C?#10.1 C?#12.1 C?#14.1 C?#15.1 C?#17.1 C?#20.1 C?#21.1 C?#22.1 C?#23.1 ESR?#1.2 ESR?#6.1 ESR?#7.1 ESR?#8.1 ESR?#12.1 ESR?#13.1 ESR?#14.1 ESR?#16.2 ESR?#19.2 Q?#4.1(C) Q?#12.1(C) Q?#15.3(E) Q?#16.1(C) Q?#17.3(E) Q?#18.1(C) Q?#19.3(E) Q?#21.3(E) Q?#22.3(E) Q?#23.3(E) Q?#24.3(E) Q?#25.3(E) Q?#27.3(E) Q?#30.3(E) Q?#31.1(C) Q?#39.3(E) Q?#40.3(E) Q?#41.3(E) Q?#50.3(E) Q?#52.3(E) R?#13.2 R?#15.1 R?#16.1 R?#17.1 R?#29.2 R?#32.1 R?#38.1 R?#45.1 R?#48.1 R?#49.1 R?#53.1 R?#56.1 R?#69.1 R?#79.1 R?#95.2 R?#97.1
GND_1: 1UF#1.1 1UF#2.1 C?#11.1 C?#13.1 D?#1.2(K) Q?#26.3(E) R?#21.1 R?#23.1 R?#33.1 R?#50.1 R?#65.1
VCC: ESR?#3.2 ESR?#4.2 ESR?#5.2 ESR?#9.2 ESR?#10.2 ESR?#11.2 Q2#3.3(E) Q3#3.3(E) Q?#1.1(C) Q?#2.3(E) Q?#3.3(E) Q?#8.1(C) Q?#35.3(E) Q?#36.3(E) Q?#45.1(C) Q?#47.1(C) R1#3.2 R?#1.2 R?#2.2 R?#3.2 R?#4.2 R?#5.2 R?#6.2 R?#25.2 R?#27.1 R?#27.2 R?#28.2 R?#31.2 R?#35.1 R?#36.2 R?#39.2 R?#40.2 R?#41.2 R?#42.2 R?#43.2 R?#58.2 R?#59.2 R?#60.2 R?#87.2 U?#1.2(IN+)
VCC_8: 1K.2 100K#1.2 R1#1.2 R1#2.2 R?#18.2 R?#20.2 R?#24.2 R?#44.2 R?#61.2
VOUT: U?#1.3(OUT)
VREF: U?#1.1(IN-)
放电_7: Q?#23.1(C) Q?#24.1(C) Q?#25.1(C) Q?#27.1(C) Q?#30.1(C) R1#1.1 R1#2.1 R2#1.2 R2#2.2
浮地: C?#16.1 C?#18.1 C?#19.1 Q?#37.3(E) Q?#44.3(E) Q?#46.3(E) R?#75.2 R?#88.2
触发_2: 1UF#1.2 1UF#2.2 100K#1.1 100K#2.1 C?#11.2 C?#13.2 R2#1.1 R2#2.1  [also labelled 阈值_6]
输入_5: R?#18.1 R?#19.2
Net1K_1: 1K.1 100K#2.2 Q?#26.1(C)
NetC?#1_2: C?#1.2 ESR?#1.1
NetC?#2_2: C?#2.2 ESR?#2.1
NetC?#3_2: C?#3.2 R?#29.1
NetC?#4_2: C?#4.2 R?#31.1
NetC?#5_2: C?#5.2 R?#34.1 U?#2.1(IN-)
NetC?#7_2: C?#7.2 ESR?#15.1
NetC?#8_2: C?#8.2 ESR?#16.1
NetC?#9_2: C?#9.2 R?#46.1 U?#3.1(IN-) U?#4.1(IN-)
NetC?#10_2: C?#10.2 ESR?#17.1
NetC?#12_2: C?#12.2 R?#57.1 U?#5.1(IN-) U?#6.1(IN-)
NetC?#14_2: C?#14.2 R?#63.2 U?#8.2(IN+)
NetC?#15_2: C?#15.2 R?#70.1 U?#7.1(IN-) U?#8.1(IN-)
NetC?#16_2: C?#16.2 Q?#37.1(C) R?#71.2 U?#10.2(IN+)
NetC?#17_2: C?#17.2 R?#80.1 U?#9.1(IN-) U?#10.1(IN-)
NetC?#18_2: C?#18.2 Q?#46.1(C) R?#86.2 U?#11.2(IN+)
NetC?#19_2: C?#19.2 D?#3.2(K) R?#83.2
NetC?#20_2: C?#20.2 R?#98.1 U?#11.1(IN-) U?#12.1(IN-)
NetC?#22_2: C?#22.2 ESR?#18.1
NetC?#23_2: C?#23.2 ESR?#19.1
NetD?#1_1: D?#1.1(A) R?#64.1
NetD?#3_1: D?#3.1(A) Q?#44.2(B)
NetESR?#3_1: ESR?#3.1 ESR?#5.1 ESR?#6.2
NetESR?#4_1: ESR?#4.1 ESR?#7.2 ESR?#8.2
NetESR?#9_1: ESR?#9.1 ESR?#10.1 ESR?#12.2
NetESR?#11_1: ESR?#11.1 ESR?#13.2 ESR?#14.2
NetQ1#1_1: Q1#1.1(C) Q2#1.1(C) Q?#6.1(C) Q?#6.2(B) Q?#7.2(B)
NetQ1#1_3: Q1#1.3(E) Q2#1.2(B)
NetQ1#2_1: Q1#2.1(C) R?#40.1
NetQ1#2_3: Q1#2.3(E) Q2#2.3(E) R?#48.2
NetQ1#3_2: Q1#3.2(B) Q2#3.1(C) Q2#3.2(B) Q3#3.2(B)
NetQ1#3_3: Q1#3.3(E) R1#3.1
NetQ2#1_3: Q2#1.3(E) Q3#2.3(E) R?#16.2
NetQ2#2_1: Q2#2.1(C) R?#41.1
NetQ3#1_1: Q3#1.1(C) Q3#2.1(C) Q?#4.2(B) Q?#5.1(C) Q?#5.2(B)
NetQ3#1_2: Q3#1.2(B) R?#6.1 R?#11.2
NetQ3#1_3: Q3#1.3(E) Q3#2.2(B)
NetQ?#1_2: Q?#1.2(B) Q?#10.1(C) Q?#11.1(C) Q?#11.2(B) R?#5.1
NetQ?#1_3: Q?#1.3(E) Q?#8.2(B) R?#7.2
NetQ?#2_1: Q?#2.1(C) Q?#2.2(B) Q?#3.2(B) Q?#9.2(B) R?#8.2
NetQ?#3_1: Q?#3.1(C) Q?#10.2(B) Q?#17.1(C) R?#9.2
NetQ?#4_3: Q?#4.3(E) Q?#7.3(E) R?#2.1
NetQ?#5_3: Q?#5.3(E) R?#3.1
NetQ?#6_3: Q?#6.3(E) R?#1.1
NetQ?#7_1: Q?#7.1(C) Q?#19.2(B) Q?#21.1(C) R?#9.1
NetQ?#8_3: Q?#8.3(E) Q?#11.3(E) Q?#15.1(C) R?#7.1
NetQ?#9_1: Q?#9.1(C) Q?#12.3(E) Q?#13.3(E)
NetQ?#9_3: Q?#9.3(E) R?#4.1
NetQ?#10_3: Q?#10.3(E) R?#10.2 R?#12.1 R?#13.1
NetQ?#12_2: Q?#12.2(B) Q?#16.3(E)
NetQ?#13_1: Q?#13.1(C) Q?#21.2(B) R?#17.2
NetQ?#13_2: Q?#13.2(B) Q?#18.3(E)
NetQ?#14_1: Q?#14.1(C) Q?#14.2(B) Q?#20.3(E) R?#8.1
NetQ?#14_3: Q?#14.3(E) Q?#17.2(B) Q?#19.1(C)
NetQ?#15_2: Q?#15.2(B) R?#10.1
NetQ?#16_2: Q?#16.2(B) R?#11.1 R?#15.2
NetQ?#20_1: Q?#20.1(C) Q?#22.2(B) R?#12.2
NetQ?#20_2: Q?#20.2(B) R?#14.1
NetQ?#28_1: Q?#28.1(C) R?#42.1
NetQ?#28_3: Q?#28.3(E) Q?#29.3(E) R?#49.2
NetQ?#29_1: Q?#29.1(C) R?#43.1
NetQ?#31_2: Q?#31.2(B) Q?#32.1(C) Q?#32.2(B)
NetQ?#31_3: Q?#31.3(E) Q?#34.3(E) R?#60.1
NetQ?#32_3: Q?#32.3(E) R?#59.1
NetQ?#33_1: Q?#33.1(C) Q?#33.2(B) Q?#34.2(B)
NetQ?#33_3: Q?#33.3(E) R?#58.1
NetQ?#35_1: Q?#35.1(C) Q?#35.2(B) Q?#36.2(B)
NetQ?#36_1: Q?#36.1(C) Q?#39.1(C) R?#78.2
NetQ?#37_2: Q?#37.2(B) R?#72.2 R?#75.1
NetQ?#38_1: Q?#38.1(C) Q?#38.2(B) R?#77.1
NetQ?#38_3: Q?#38.3(E) Q?#39.2(B) Q?#40.1(C)
NetQ?#40_2: Q?#40.2(B) Q?#41.1(C) R?#78.1
NetQ?#43_1: Q?#43.1(C) R?#82.2 R?#86.1
NetQ?#43_2: Q?#43.2(B) R?#81.2 R?#84.1
NetQ?#44_1: Q?#44.1(C) R?#84.2
NetQ?#45_2: Q?#45.2(B) Q?#48.1(C) Q?#49.1(C) Q?#49.2(B) R?#87.1
NetQ?#45_3: Q?#45.3(E) Q?#47.2(B) R?#89.2
NetQ?#46_2: Q?#46.2(B) R?#85.2 R?#88.1
NetQ?#47_3: Q?#47.3(E) Q?#49.3(E) Q?#50.1(C) R?#89.1
NetQ?#48_3: Q?#48.3(E) R?#90.2 R?#94.1 R?#95.1
NetQ?#50_2: Q?#50.2(B) R?#90.1
NetQ?#51_1: Q?#51.1(C) Q?#52.2(B) R?#94.2
NetQ?#51_2: Q?#51.2(B) R?#96.1
NetR?#19_1: R?#19.1 R?#21.2
NetR?#20_1: R?#20.1 R?#22.2
NetR?#22_1: R?#22.1 R?#23.2
NetR?#24_1: R?#24.1 R?#30.2
NetR?#25_1: R?#25.1 R?#26.1 R?#34.2 U?#2.3(OUT)
NetR?#26_2: R?#26.2 R?#28.1 R?#32.2 U?#2.2(IN+)
NetR?#30_1: R?#30.1 R?#33.2
NetR?#35_2: R?#35.2 R?#38.2 U?#4.2(IN+)
NetR?#36_1: R?#36.1 R?#37.1 R?#46.2 U?#3.3(OUT)
NetR?#37_2: R?#37.2 R?#39.1 R?#45.2 U?#3.2(IN+)
NetR?#44_1: R?#44.1 R?#47.2
NetR?#47_1: R?#47.1 R?#50.2
NetR?#51_2: R?#51.2 R?#53.2 U?#5.2(IN+)
NetR?#52_1: R?#52.1 R?#54.1 R?#57.2 U?#6.3(OUT)
NetR?#54_2: R?#54.2 R?#55.1 R?#56.2 U?#6.2(IN+)
NetR?#61_1: R?#61.1 R?#62.2
NetR?#62_1: R?#62.1 R?#65.2
NetR?#66_1: R?#66.1 R?#67.1 R?#70.2 U?#7.3(OUT)
NetR?#67_2: R?#67.2 R?#68.1 R?#69.2 U?#7.2(IN+)
NetR?#73_1: R?#73.1 R?#74.1 R?#80.2 U?#9.3(OUT)
NetR?#74_2: R?#74.2 R?#76.1 R?#79.2 U?#9.2(IN+)
NetR?#91_1: R?#91.1 R?#92.1 R?#98.2 U?#12.3(OUT)
NetR?#92_2: R?#92.2 R?#93.1 R?#97.2 U?#12.2(IN+)

Not connected (* = marked no-connect by the designer): D?#2 1(A) 2(K); D?#4 1(A) 2(K); Q1#1 2(B); Q1#2 2(B); Q1#3 1(C); Q2#2 2(B); Q3#3 1(C); Q?#18 2(B); Q?#22 1(C); Q?#23 2(B); Q?#24 2(B); Q?#25 2(B); Q?#26 2(B); Q?#27 2(B); Q?#28 2(B); Q?#29 2(B); Q?#30 2(B); Q?#34 1(C); Q?#41 2(B); Q?#42 1(C) 2(B) 3(E); Q?#48 2(B); Q?#51 3(E); Q?#52 1(C); R?#14 2; R?#64 2; R?#77 2; R?#96 2; U?#4 3(OUT); U?#5 3(OUT); U?#8 3(OUT); U?#10 3(OUT); U?#11 3(OUT)

## Notes on the sheet
- (near Q?#9) wilson电流镜
- 触发器比较输出
- 输出
- 比较器输出
- (near R?#9) 复位
- 比较器正端
- 阈值
- (near Q3#1) 比较器负端
- (near R?#11) 2/3VCC
- (near Q?#18) 触发
- (near Q?#16) 比较器正端
- (near R?#15) 1/3VCC
- 复位
- (near R?#17) 比较输出
- (near Q?#21) 触发比较器输出
- 放电
- 系统框图
- 方波的产生
- RC充电回路
- 比较器生成PWM电路
- VCC >  VREF时，Vout  = VCC
- 比较器
- +
- -
- R
- 输出驱动
- 2.9V
- VCC <  VREF时，Vout  = GND
- S
- 触发器
- 三角波形需要的条件：
- （1）不能太缓慢
- 电容只有上升和下降中间的一段接近线性
- （2）电压不能太低
- (near C?#2) 0V
- (near C?#1) 0V
- 20V
- 0.8V
- 去掉接近电源2/3处和接近地的1/3处
- 0V
- 三角形波形产生：电阻、电容、电感器件选择
- (near ESR?#5) 2/3Vcc
- (near ESR?#8) 1/3Vcc
- 18mA
- 20mA
- 18V
- RC放电回路
- 14mA
- 16mA
- 12mA
- 12V
- 14V
- 16V
- 10mA
- 8mA
- 4mA
- 6mA
- 10V
- 4V
- 6V
- 8V
- 当正输入大于负输入时，比较器输出高电压VCC
- 充电
- 当正输入小于负输入时，比较器输出高电压VCC
- -2mA
- -4mA
- 2mA
- 0mA
- -2V
- -4V
- 2V
- t
- 555是一个相对简单的电路，其核心由以下三个基本元件组成:
  1)分压器
  2)两个电压比较器
  3)触发器逻辑门
- -10mA
- -12mA
- -6mA
- -8mA
- -10V
- -12V
- -8V
- -6V
- (near ESR?#10) 2/3Vcc
- (near ESR?#14) 1/3Vcc
- 比较器:比较器是一种电路元件，用于比较其(+)和(-)输入端的两个模拟输入电压
  如果(+)输入端的电压高于(-)输入端，它会产生逻辑高（或真)的输出电压，否则会产生低（或假)的输入电压
- -14mA
- -16mA
- -14V
- -16V
- 差分放大器比较器电路
- 1、电容充电到0V时，电容两端的压差为0V，剩余20V电压全部在电阻上
- I = C
- dv
- dt
- 电容两端的压差越大，流入流出电流越大，充电斜率越大
- RC形成三角波
- 正输入端电阻等效电路
- 比较器输出端电容等效电路
- 3、电容充电到10V时，电容两端的压差为10V，剩余10V电压全部在电阻上
- 2、电容充电到15V时，电容两端的压差为15V，剩余5V电压全部在电阻上
- 2、电容充电到5V时，电容两端的压差为5V，剩余15V电压全部在电阻上
- (near C?#7) 0V
- (near C?#7) 20V
- (near C?#8) 0V
- 当阈值输入上的电压高于参考输入(2/3Vcc)上的电压时，电路中的电流主要来自左侧，
  通过Q1、Q2(记住电路是对称的）当阈值电压降至参考电压以下时，电路改变状态，大部分电流流过Q3和Q4
- 差分放大电路：
  两个达林顿对Q1、Q2和Q3、Q4形成差分放大器
  使用达林顿对(具有高增益）可以减少从比较器输入端汲取的电流差分放大器本身的作用有点像跷跷板:
  当阈值输入上的电压高于参考输入(2/3Vcc)上的电压时，电路中的电流主要来自左侧，通过Q1、Q2(记住电路是对称的）当阈值电压降至参考电压以下时，电路改变状态，大部分电流流过Q3和Q4
- 线性
- 充电结束维持阶段
- 电容充电存在一段接近线性变化的区间
- 放电回路需要使用一个三极管来控制电流留出，同时我们发现NE555内部有一个放电引脚
- 上升充电阶段
- 放电回路
- (near Q1#2) 3V
- 充电回路
- 直流电平
- (near Q1#2) ON
- (near Q2#2) OFF
- 1V
- (near Q?#28) OFF
- (near Q?#29) ON
- (near Q?#29) 3V
- (near C?#10) 0V
- 在左侧的情况下，放大器的输入为3V(左输入)和1V（右输入)由于左输入较高
- 左晶体管导通更强，通过其集电极吸引更多电流发射极的电压饱和到1.4V
- 关闭另一个晶体管（因为发射极电压高于基极电压)
- 占空比小于50%的方波生成
- 方波产生电路
- PWM软启动电路设计
- 区间1
- 阈值比较器一端接2/3VCC：
- 2/3V cc必须大于达林顿导通电压
- 充电回路阻抗（不考虑电容）：
- 放电回路阻抗（不考虑电容）：
- R1+R2
- R2
- 三角波和直流电平相切
- 触发比较器一端接1/3VCC：
- 1/3Vcc不一定能导通达林顿，所以使用P管，低电压导通
- 占空比大小就取决于充放电斜率，而在电压一定的情况下，斜率就由电阻确定了
- 前面讲到电容充电的斜率取决于电压和阻抗，电压越大，阻抗越小，电流充电斜率越高
- 例如：R1为100K，R2为100K
- R1+R2 = 200K
- R2 = 100K
- 充电慢，放电快
- 占空比大于50%
- 初始上电，直流电平快速上升，并且超过三角波，比较器输出高电平，MOS管打开
- MOS管打开后，电感开始快速充电，这个时候若干个周期都出现了100%占空比
- 触发比较器的工作原理与阈值比较器的第一部分（下部）相似，只是它是倒置的
- 希望刚上电时候，直流电平的上升速度小于三角波
- 如果三角波形成时间较长，则电感容易饱和，烧毁
- 它们颠倒的原因是为了确保共模输入电压范围一直能延伸到零
- 它放大来自第一差分放大器的信号并增加整体增益
- 控制LED亮灭
- 电平触发
- 高保持
- 要想三角波电容上面有一定抗干扰能力和带载能力就需要R小C大
- 低保持
- 我们的三角波充电慢放电快
- 给三角波电容充电的时间就是23k*1nF=23us（定性）
- 实际上你还要去掉一个低1/3还要去掉一个顶2/3那就是小于23us
- 1k*1nF=lus
- 直流电平要像上图一样缓慢上升并且趋于稳定，这里面至少要包含几十个周期
- 三角波的频率等于开关频率
- 不管开关频率是10K、50K、100K，都要你直流电平缓慢上升
- (near Q?#31) 镜像电流源
- 我们所有的设计都是依据设计的底层逻辑与考虑的对象
- 由于这里给三角波供电的是自举电容所以就需要精打细算
- 65khz=15.38us和估算的小于23us差不多
- 直流电平缓慢上升代表的是一个软启的过程
- 对于三角波来说是一个RC（t1）
- 对于直流电平来说也可以使用RC（t2）进行软启动
- 占空比等于50%的方波生成
- 保证直流电平t2要远远大于三角波t1
- 在三角波形成后，直流电平接近三角波，这样避免100%的占空比产生
- 做延时电路的几个要素：
- 斜率包含两个信息，第一个是幅值阀值电压，第二是延时时间
- Widlar电流源
- 要做斜率一定要做RC延时，再做一个阈值就产生了延时时间
- RC（斜率）+V（阀值）=时间
- 也就是说我要在三极管Q4的基极上我要看到RC与阀值
- Q2和Q3形成电流境，Q1作为额外的输出晶体管
- 与Q3并联，跟随Q2的电流变化
- (near Q3#3) 与Q3不同的是，通过Q1的电流不是直接复制的，而是除以R1确定的固定比率
- Th≃
- TL≃
- T = Th + TL
- 0.693 * (R1 + R2) * C
- 0.693 *  R2 * C
- (near U?#8) 直流电平
- f
- 1
- F
- ≃
- (R1 + 2R2) * C
- 1.44
- (near U?#8) RC形成三角波
- PWM直流电平幅值限制电路设计
- RS触发器
- 方案一：使用三极管
- 占空比大于50%的方波生成
- 阈值比较器输出
- 为了限制直流电平不能超过三角波的最高电平，防止100%的PWM占空比产生
- C2电容电压超过三极管基级电压时，三极管导通，将三极管集电极电压钳位
- 由于三极管发射极没有电阻，导通后类似与导线，将电容电流放电
- (near U?#10) 直流电平
- 设计电路能用无源器件就坚决不用有源器件
- 如果用稳压管，稳压管的偏差比较大，放到三角波里面不合适
- (near Q?#38) 0.7V
- (near U?#10) RC形成三角波
- 触发比较器输出
- PWM直流电平启动电路设计
- 阈值比较器
- 0
- 触发比较器
- 稳态比较输出
- 保持
- Q
- 正确的占空比小于50%的方波生成
- 如果直流电平启动时间都大于自举电容从16V掉到欠压（8V）了这个电路肯定跑不起来
- 不稳定
- 后级电路的正常工作需要多个PWM才能正常工作起来
- 直流电平最缓慢的这段时间要远远小于自举电容从16V掉到欠压（8V）的时间
- 直流电平最缓慢的这段时间也不能太短，否则三角波还没起来直流电平第二段就与三角波相切了
- 这样就满足了前期启动电路直流电平小于三角波，同时提升后期PWM调整的瞬态响应时间
- 如果在自举电容第一个周期内，后级电路没有稳定工作，则会出现打嗝
- 所以需要在直流电平软启动到某个电压，然后转换成更快的充电斜率，让PWM更快工作起来
- (near Q?#42) 延时2开启 > 延时1开启
- (near Q?#42) Q2为什么要使用P管，不使用N管？
- 如果使用N管，发射级会与后面的电路形成负反馈，使三极管处于放大区间
- 同时会与后级形成形成恒流源，电容充电电流被限制
- 为什么使用延时启动，不使用双阈值电压判断来处理？
- RS触发器比较输出
- 限幅电压
- (near U?#11) 直流电平
- 充电快，放电慢
- (near U?#11) 三角波
- 充电和放电一致
- 调整充放电时间和占空比
- 从低电压充电到高电压以及放电高电压变成低电压，本质是电流流入和留出
- 改变回路中的阻抗就改变了电流大小，改变电流大小就改变了斜率
- 根据电容2端高电平和低电平来确定阈值区间，从而改变电阻分压阈值，改变阈值电压
- 改变斜率，充放电时间就改变了，从而充放电频率就改变了
- (near C?#22) 0V
- (near C?#22) 20V
- (near C?#23) 0V
- 方波实现方法1：定直流电平，调整充放电时间
- 方波实现方法2：定充放电时间，调整直流电平
- 注意：输出的方波与三角波的形状没有关系
- Labels drawn without touching a wire or pin: 复位_4, 输出_3

## Library data of the parts
1K 100K#1 100K#2 ESR?#1-ESR?#19 R1#1-R1#3 R2#1 R2#2 R?#1-R?#28 R?#30 R?#32 R?#33 R?#35-R?#45 R?#47-R?#56 R?#58-R?#69 R?#71-R?#79 R?#81-R?#97 = Resistor: TC1: 0; SimulationGenericComponent: True; TC2: 0
1UF#1 1UF#2 C?#3-C?#9 C?#11-C?#23 = Capacitor: SimulationGenericComponent: True
C?#1 C?#2 C?#10 = Capacitor: SimulationGenericComponent: True; Value: 10uF
D?#1 = LED: AF: 1; BV: 0; BV_MAX: 1e99; EG: 1.11; FC: 0.5; IBV: 0.001; IS: 1e-14; MJSW: 0.33; NTUN: 30; TNOM: 27; XTI: 3; SimulationGenericComponent: True; CJO: 0; CJP: 0; CTA: 0; CTP: 0; FCS: 0.5; FV_MAX: 1e99; IKF: 0; IKR: 0; ISR: 1e-14; JSW: 0; JTUN: 0; JTUNSW: 0; KEG: 1; KF: 0; LEVEL: 1; N: 1; NBV: 1; NR: 1; NS: 1; PHP: 1; RS: 0; TCV: 0; TLEV: 0; TLEVC: 0; TM1: 0; TM2: 0; TPB: 0; TPHP: 0; TRS: 0; TRS2: 0; TT: 0; TTT1: 0; TTT2: 0; VJ: 1; XTITUN: 3
D?#2-D?#4 = 1N4148W_C7420318: Symbol: 1N4148W_C7420318
Q1#1 Q1#2 Q2#1 Q2#2 Q3#1 Q3#2 Q?#1 Q?#8 Q?#10 Q?#14 Q?#15 Q?#17 Q?#19 Q?#21-Q?#30 Q?#37-Q?#41 Q?#44-Q?#48 Q?#50 Q?#52 = BJT NPN VBIC: SimulationGenericComponent: True; AFN: 1; AJC: -0.5; ART: 0.1; AVC1: 0; EA: 1.12; FC: 0.9; IBBE: 1e-06; IBCI: 1e-16; IBEI: 1e-18; MC: 0.33; NCN: 2; NKF: 0.5; PC: 0.75; TNOM: 27; VERS: 1.2; XII: 3; AJE: -0.5; AJS: -0.5; AVC2: 0; BFN: 1; CBCO: 0; CBEO: 0; CCSO: 0; CJC: 0; CJCP: 0; CJE: 0; CJEP: 0; CTH: 0; DEAR: 0; EAIC: 1.12; EAIE: 1.12; EAIS: 1.12; EANC: 1.12; EANE: 1.12; EANS: 1.12; EAP: 1.12; EBBE: 0; GAMM: 0; HRCF: 1; IBCIP: 0; IBCN: 0; IBCNP: 0; IBEIP: 0; IBEN: 0; IBENP: 0; IKF: 0; IKP: 0; IKR: 0; IS: 1e-16; ISP: 0; ISRR: 1; ITF: 0; KFN: 0; ME: 0.33; MS: 0.33; NBBE: 1; NCI: 1; NCIP: 1; NCNP: 2; NEI: 1; NEN: 2; NF: 1; NFP: 1; NR: 1; PE: 0.75; PS: 0.75; QBM: 0; QCO: 0; QTF: 0; RBI: 0.1; RBP: 0.1; RBX: 0; RCI: 0.1; RCX: 0; RE: 0; RS: 0; RTH: 0; TAVC: 0; TD: 0; TF: 0; TNBBE: 0; TNF: 0; TR: 0; TVBBE1: 0; TVBBE2: 0; VBBE: 0; VEF: 0; VER: 0; VO: 0; VREF: 0; VRT: 0; VTF: 0; WBE: 1; WSP: 1; XIKF: 0; XIN: 3; XIS: 3; XISR: 0; XRBI: 0; XRBP: 0; XRBX: 0; XRCI: 0; XRCX: 0; XRE: 0; XRS: 0; XTF: 0; XVO: 0
Q1#3 Q2#3 Q3#3 Q?#2-Q?#7 Q?#9 Q?#11-Q?#13 Q?#16 Q?#18 Q?#20 Q?#31-Q?#36 Q?#42 Q?#43 Q?#49 Q?#51 = BJT PNP GP: BF: 100; AF: 0; BR: 1; EG: 1.11; FC: 0.5; IS: 1e-16; MJC: 0.33; NC: 2; NE: 1.5; TNOM: 27; VBC_MAX: 1e99; VJC: 0.75; XTI: 3; SimulationGenericComponent: True; CJC: 0; CJE: 0; CJS: 0; CTC: 0; CTE: 0; CTS: 0; IKF: 0; IKR: 0; IRB: 0; ISC: 0; ISE: 0; ISS: 0; ITF: 0; KF: 0; MJE: 0.33; MJS: 0; NF: 1; NKF: 0.5; NR: 1; NS: 1; PTF: 0; RB: 0; RBM: 0; RC: 0; RE: 0; SUBS: 1; TBF1: 0; TBF2: 0; TBR1: 0; TBR2: 0; TF: 0; TIKF1: 0; TIKF2: 0; TIKR1: 0; TIKR2: 0; TIRB1: 0; TIRB2: 0; TIS1: 0; TIS2: 0; TISC1: 0; TISC2: 0; TISE1: 0; TISE2: 0; TITF1: 0; TITF2: 0; TLEV: 0; TLEVC: 0; TMJC1: 0; TMJC2: 0; TMJE1: 0; TMJE2: 0; TMJS1: 0; TMJS2: 0; TNC1: 0; TNC2: 0; TNE1: 0; TNE2: 0; TNF1: 0; TNF2: 0; TNR1: 0; TNR2: 0; TNS1: 0; TNS2: 0; TR: 0; TRB1: 0; TRB2: 0; TRC1: 0; TRC2: 0; TRE1: 0; TRE2: 0; TRM1: 0; TRM2: 0; TTF1: 0; TTF2: 0; TTR1: 0; TTR2: 0; TVAF1: 0; TVAF2: 0; TVAR1: 0; TVAR2: 0; TVJC: 0; TVJE: 0; TVJS: 0; VAF: 0; VAR: 0; VBE_MAX: 1e99; VCE_MAX: 1e99; VJE: 0.75; VJS: 0.75; VTF: 0; XCJC: 1; XTB: 0; XTF: 0
R?#29 R?#31 = Resistor: TC1: 0; SimulationGenericComponent: True; Value: 10K; TC2: 0
R?#34 R?#46 R?#57 R?#70 R?#80 R?#98 = Resistor: TC1: 0; SimulationGenericComponent: True; Value: 3.3K; TC2: 0
U?#1-U?#12 = OpAmp: SimulationGenericComponent: True